# EAGLE design motor (EAGLE 7.7.0)
REVISION: 1.0; SCH_DESC: Motor board; TEAM: RoboCup

## Sheet 1 of 2
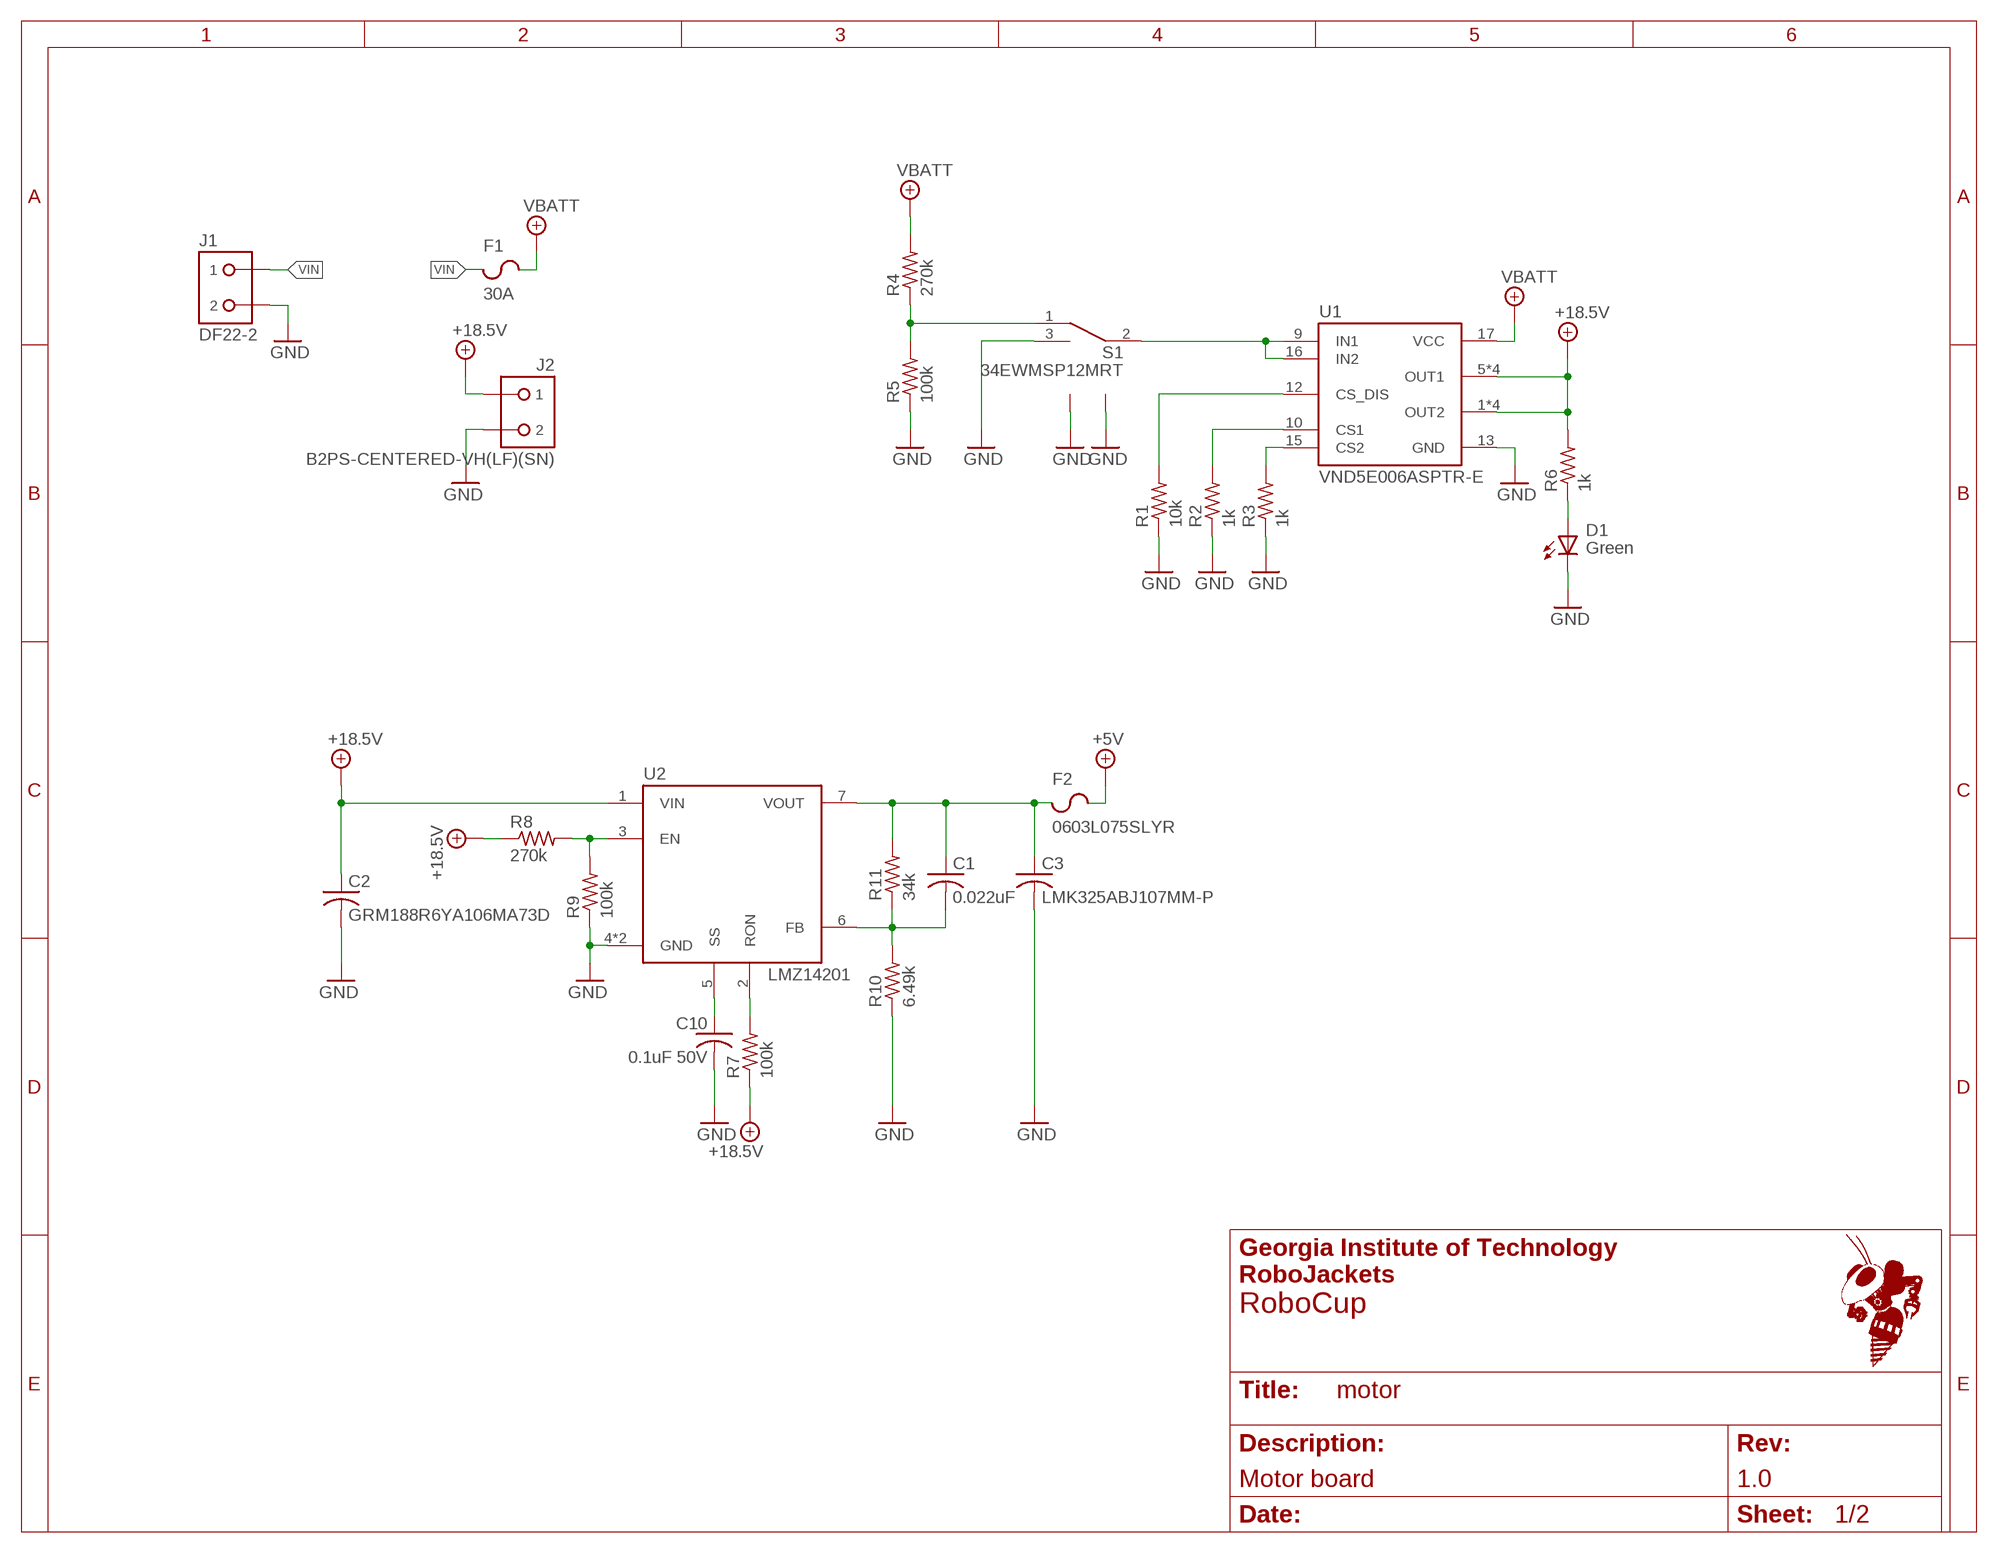
[diagram p0: schematic, sheet 1]

### Parts
C1  0.022uF  C-USC0603  [C0603]
C2  GRM188R6YA106MA73D  C-USC0603  [C0603]
C3  LMK325ABJ107MM-P  C-USC1210  [C1210]
C10  0.1uF 50V  C-USC0603  [C0603]
D1  Green  LED_SMD  [CHIP-LED0603]
F1  30A  FUSEHOLDER_3549_X2  [FUSEHOLDER_3549_X2]
F2  0603L075SLYR  CHIP_FUSE0603  [F0603]
J1  DF22-2  [DF22-2-H]
J2  B2PS-CENTERED-VH(LF)(SN)  [B2PS-CENTERED]
R1  10k  R-US_R0603  [R0603]
R2  1k  R-US_R0603  [R0603]
R3  1k  R-US_R0603  [R0603]
R4  270k  R-US_R0603  [R0603]
R5  100k  R-US_R0603  [R0603]
R6  1k  R-US_R0603  [R0603]
R7  100k  R-US_R0603  [R0603]
R8  270k  R-US_R0603  [R0603]
R9  100k  R-US_R0603  [R0603]
R10  6.49k  R-US_R0603  [R0603]
R11  34k  R-US_R0603  [R0603]
S1  34EWMSP12MRT  [34EWMSP12M6RT]
U1  VND5E006ASPTR-E  [POWERSO-16]
U2  LMZ14201  [TO-PMOD-7]

### Nets
+5V: F2.2
+18.5V: C2.1 J2.1 R6.2 R7.1 R8.1 U1.1(OUT2) U1.2(OUT2) U1.3(OUT2) U1.4(OUT2) U1.5(OUT1) U1.6(OUT1) U1.7(OUT1) U1.8(OUT1) U2.1(VIN) ; also sheet 2
GND: C2.2 C3.2 C10.2 D1.C(K) J1.2 J2.2 R1.1 R2.1 R3.1 R5.1 R9.1 R10.1 S1.3(B) S1.LEG1 S1.LEG3(LEG2) U1.13(GND) U2.4(GND) U2.PAD(GND) ; also sheet 2
N$2: R3.2 U1.15(CS2)
N$3: R2.2 U1.10(CS1)
N$4: R1.2 U1.12(CS_DIS)
N$5: R4.1 R5.2 S1.1(A)
N$6: S1.2(COMMON) U1.9(IN1) U1.16(IN2)
N$7: D1.A R6.1
N$8: C10.1 U2.5(SS)
N$9: R7.2 U2.2(RON)
N$10: R8.2 R9.2 U2.3(EN)
N$11: C1.2 R10.2 R11.1 U2.6(FB)
N$12: C1.1 C3.1 F2.1 R11.2 U2.7(VOUT)
VBATT: F1.2 F1.LEG2 R4.2 U1.17(VCC)
VIN: F1.1 F1.LEG1 J1.1

## Sheet 2 of 2
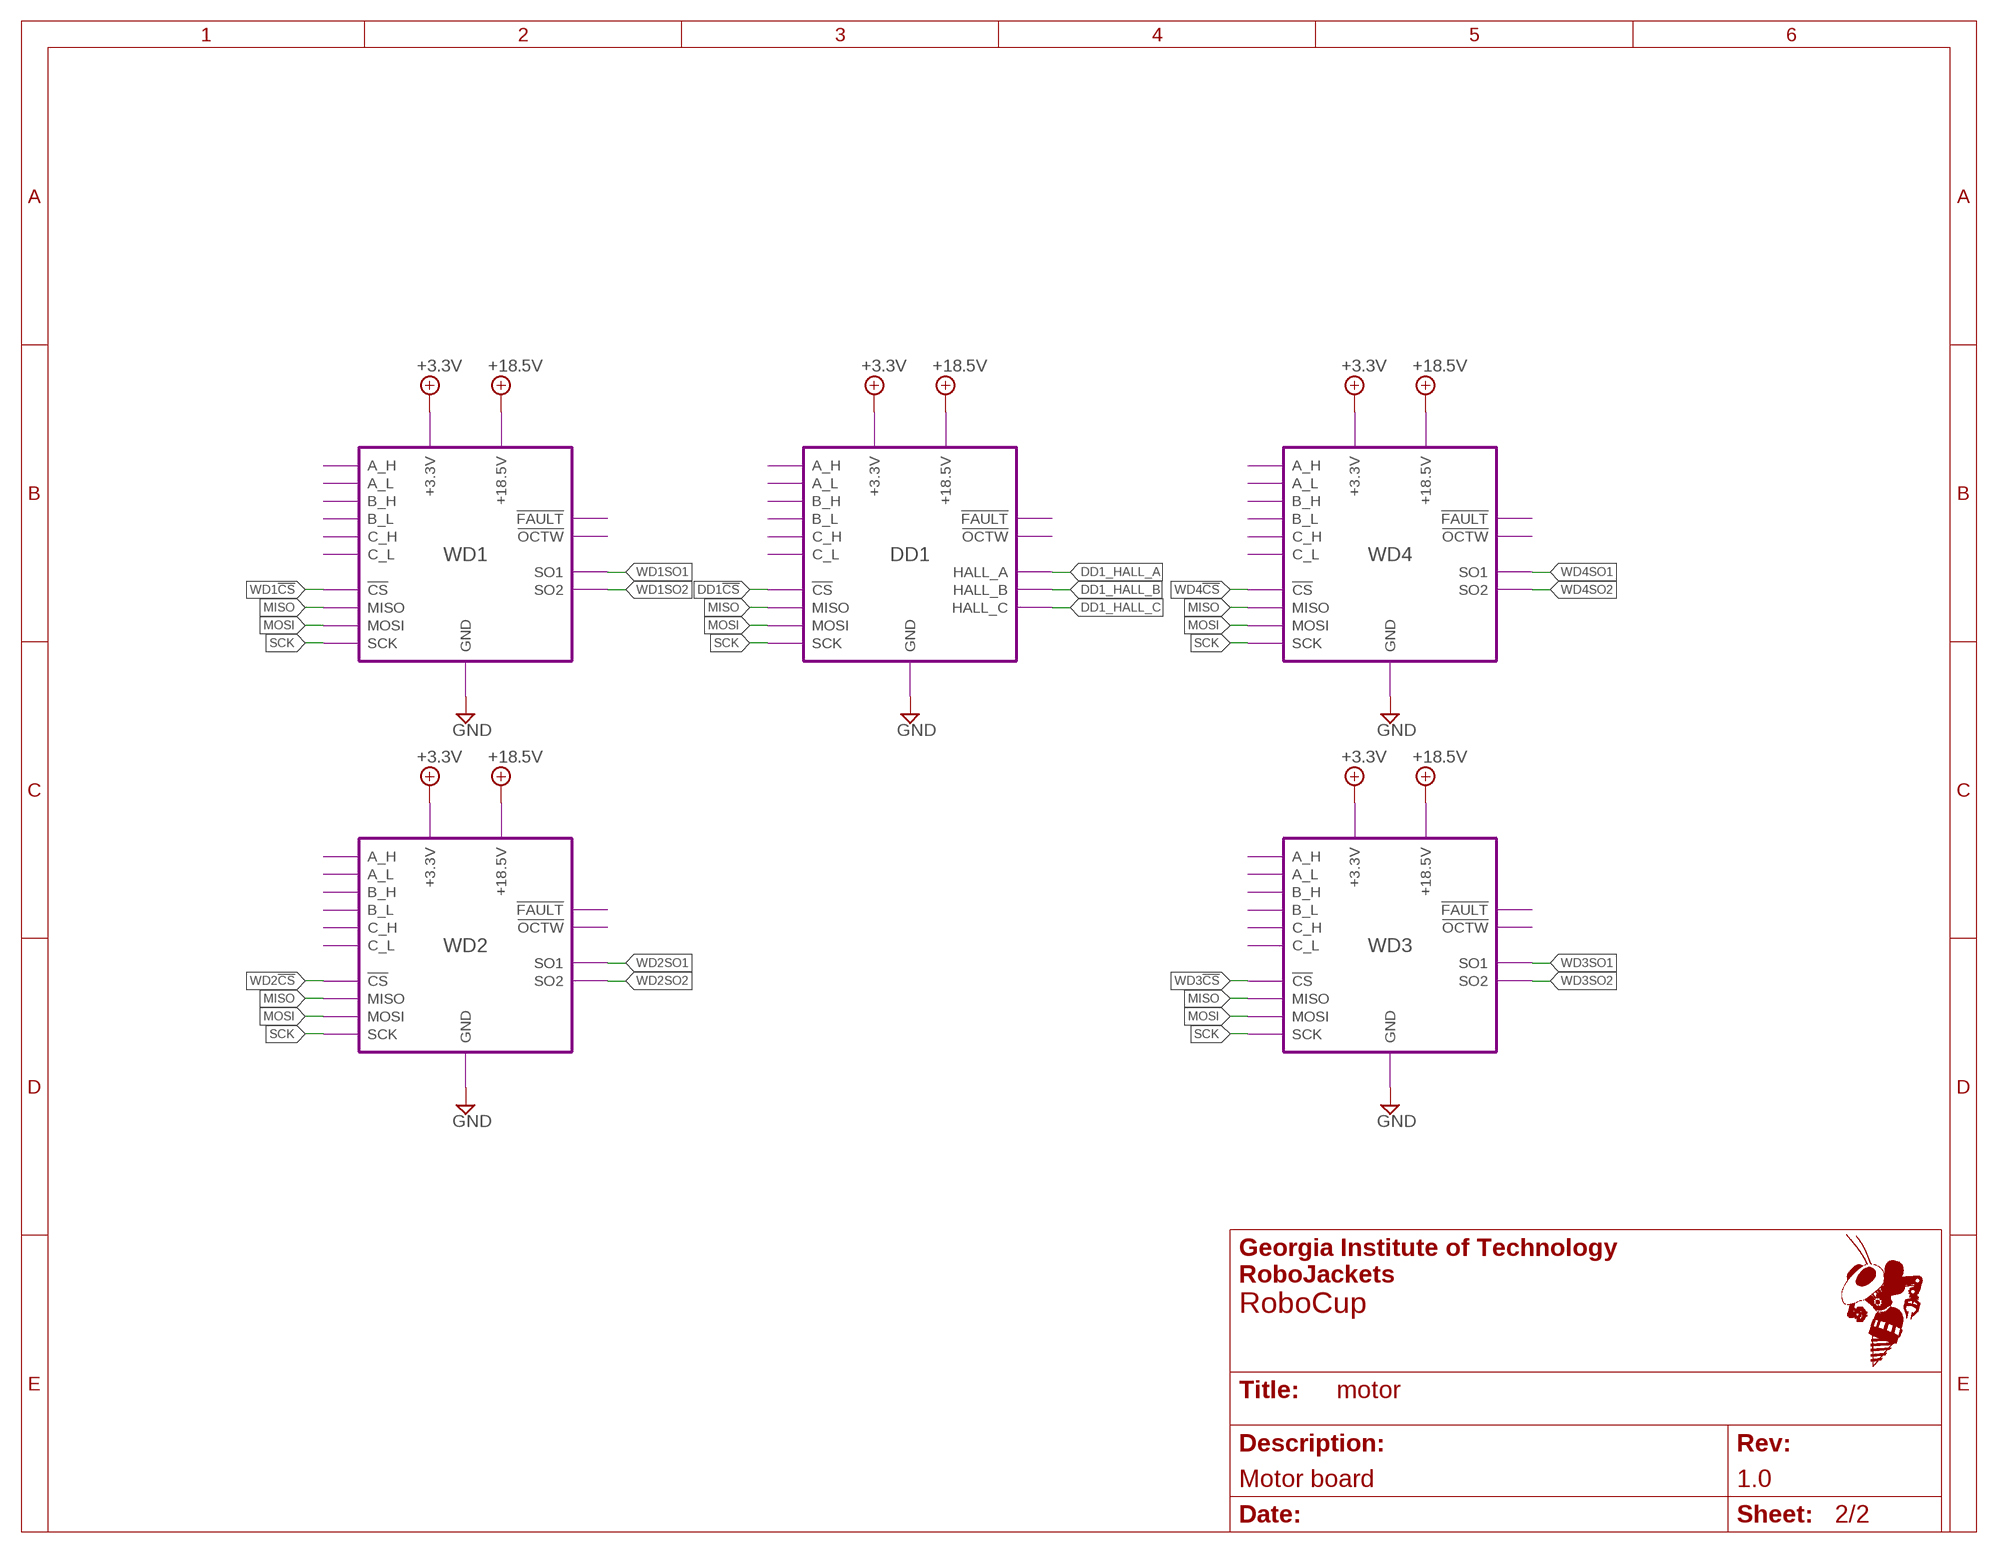
[diagram p1: schematic, sheet 2]

### Module instances
WD1 = WHEEL_DRIVE
WD2 = WHEEL_DRIVE
WD3 = WHEEL_DRIVE
WD4 = WHEEL_DRIVE
DD1 = DRIBBLER_DRIVE

### Nets
+3.3V: port WD1.+3.3V WD2.+3.3V WD4.+3.3V WD3.+3.3V DD1.+3.3V
+18.5V: port WD1.+18.5V WD4.+18.5V WD2.+18.5V WD3.+18.5V DD1.+18.5V ; also sheet 1
DD1!CS: port DD1.!CS
DD1_HALL_A: port DD1.HALL_A
DD1_HALL_B: port DD1.HALL_B
DD1_HALL_C: port DD1.HALL_C
GND: port WD1.GND WD4.GND WD3.GND WD2.GND DD1.GND ; also sheet 1
MISO: port WD1.MISO WD2.MISO DD1.MISO WD4.MISO WD3.MISO
MOSI: port WD1.MOSI WD2.MOSI DD1.MOSI WD4.MOSI WD3.MOSI
SCK: port WD1.SCK WD2.SCK DD1.SCK WD4.SCK WD3.SCK
WD1!CS: port WD1.!CS
WD1SO1: port WD1.SO1
WD1SO2: port WD1.SO2
WD2!CS: port WD2.!CS
WD2SO1: port WD2.SO1
WD2SO2: port WD2.SO2
WD3!CS: port WD3.!CS
WD3SO1: port WD3.SO1
WD3SO2: port WD3.SO2
WD4!CS: port WD4.!CS
WD4SO1: port WD4.SO1
WD4SO2: port WD4.SO2

## Library data of the parts
C1-C3 C10 = rcl:C-US: CAPACITOR, American symbol
D1 = RoboJackets-LEDs:LED_SMD
F1 = RoboJackets-Fuses:FUSEHOLDER_3549_X2: Keystone Electronics Fuse Clip 30A 500V Circuit Blade PCB 3549
F2 = RoboJackets-Fuses:CHIP_FUSE
J1 = RoboJackets-Connectors:DF22-2
J2 = RoboJackets-Connectors:B2P?-VH(LF)(SN): Power Connector Brand: JST Sales America Inc. <https://www.jst.com/> Series: VH <http://www.digikey.com/product-search/en?FV=fff40016,fff802f3,ffec0e9d> Distributor: Digi-Key <http://www.digikey.com/product-detail/en/B2PS-VH%28LF%29%28SN%29/455-1648-ND/926555>
R1-R11 = rcl:R-US_: RESISTOR, American symbol
S1 = RoboJackets-Switches:34EWMSP12MRT
U1 = RoboJackets-PowerICs:VND5E006ASPTR-E
U2 = RoboJackets-PowerICs:LMZ14201

## Module WHEEL_DRIVE
Ports: A_H(io) A_L(io) B_H(io) B_L(io) C_H(io) C_L(io) !CS(io) !FAULT(io) !OCTW(io) +18.5V(io) +3.3V(io) GND(io) MISO(io) MOSI(io) SCK(io) SO1(io) SO2(io)
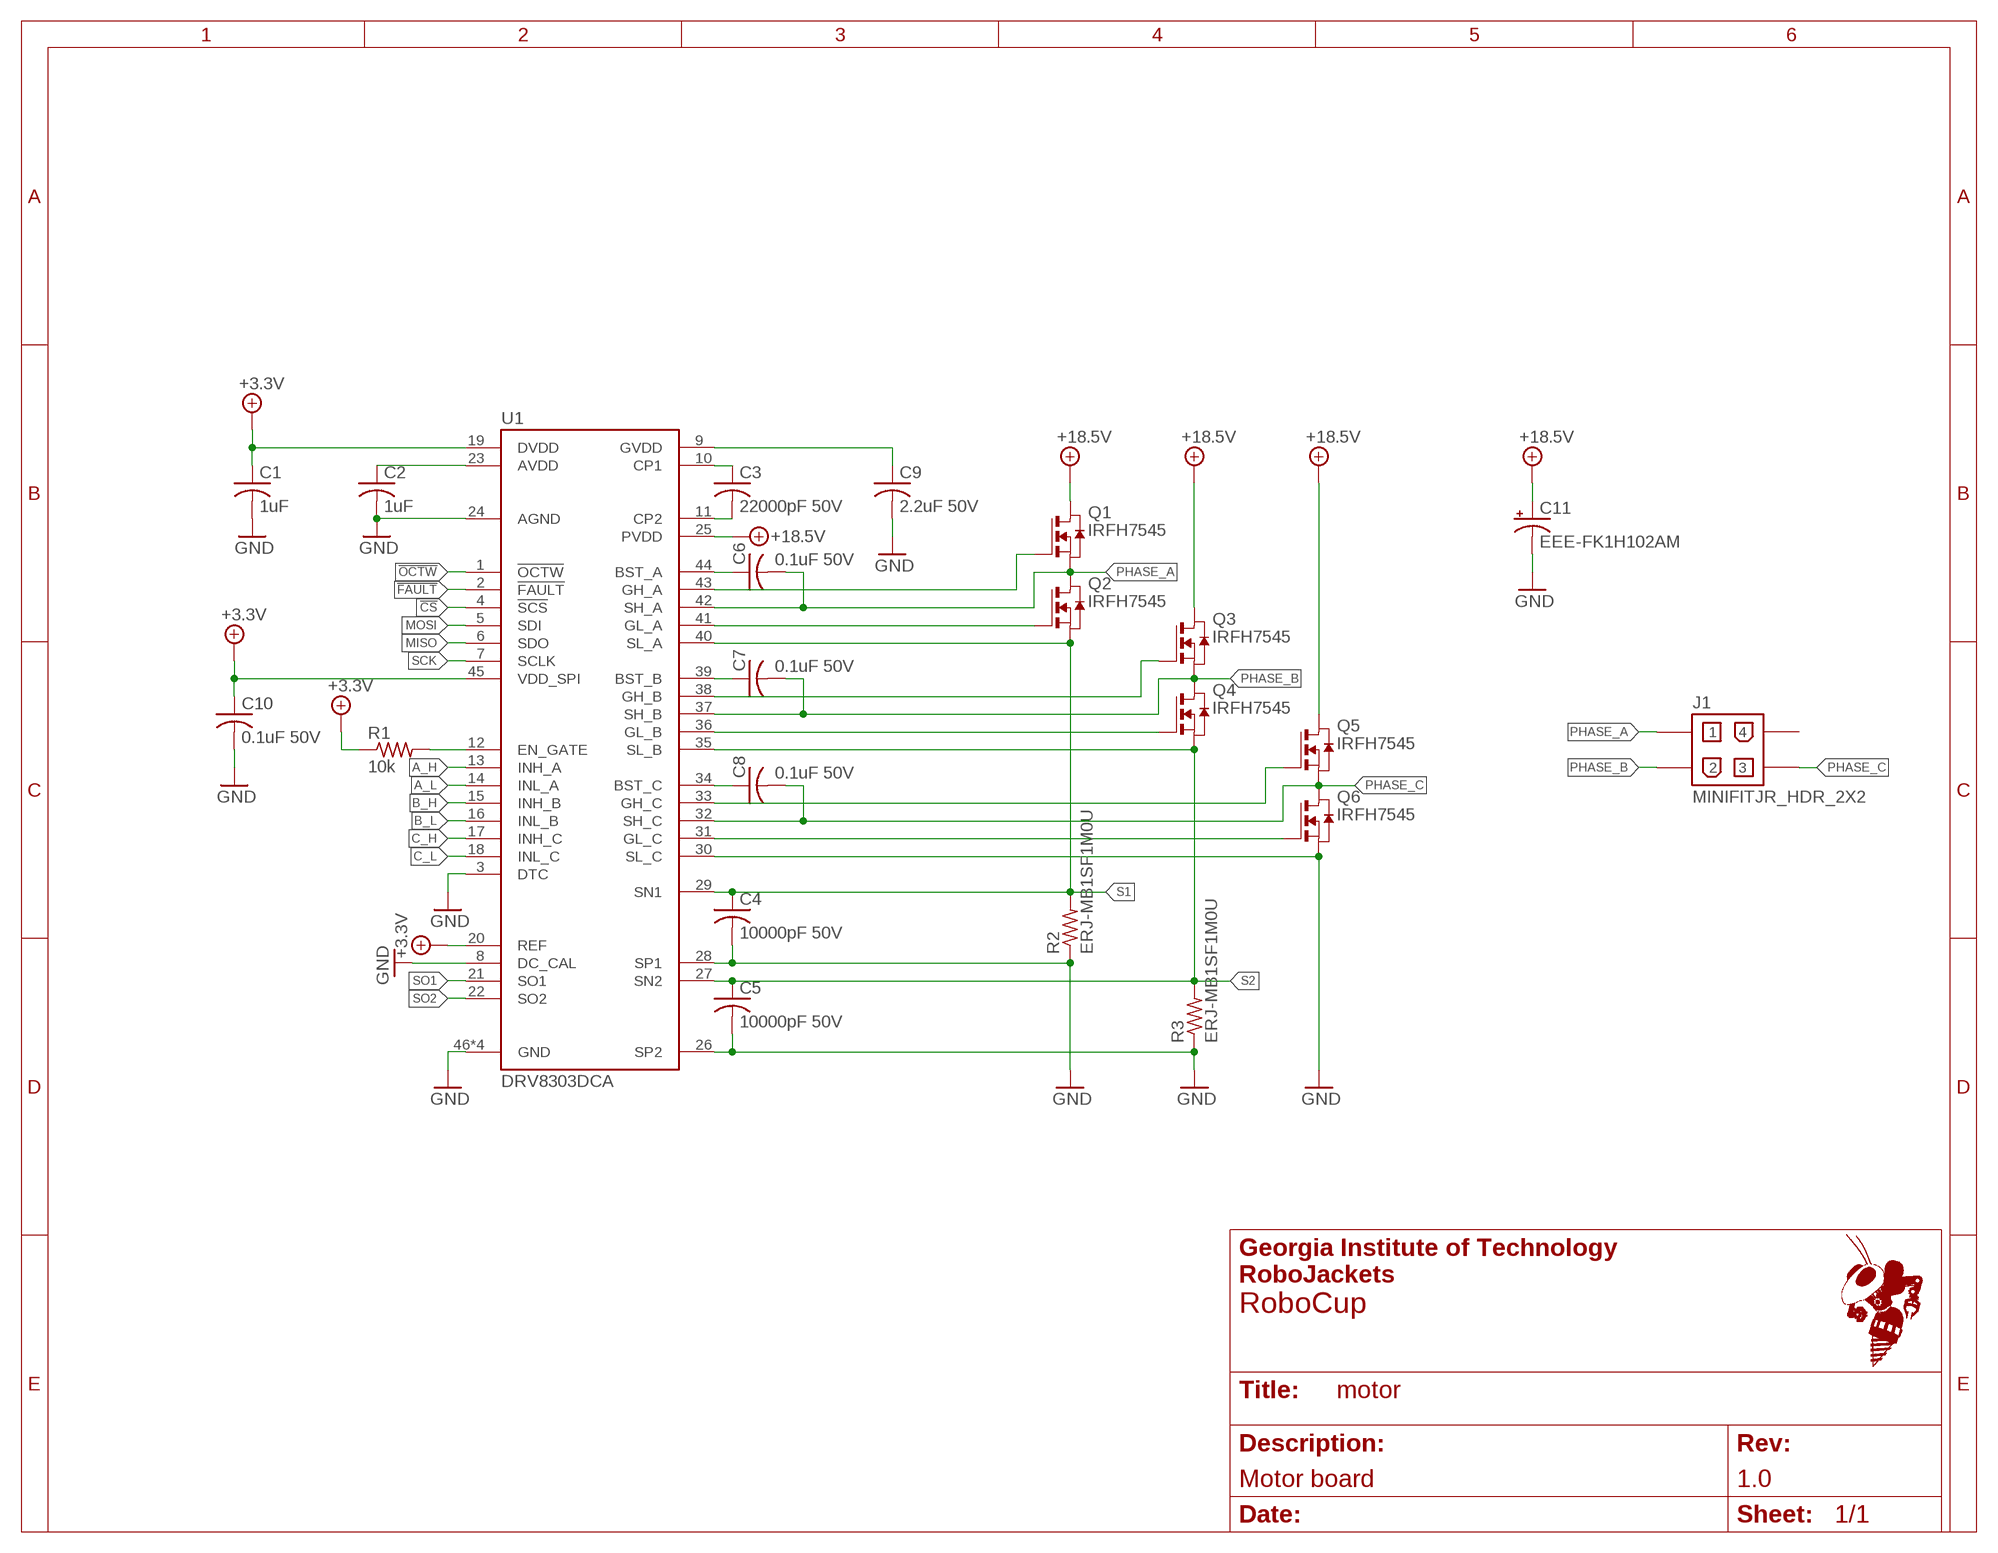
[diagram p2: schematic, module WHEEL_DRIVE, sheet 1]

### Parts
C1  1uF  C-USC0603  [C0603]
C2  1uF  C-USC0603  [C0603]
C3  22000pF 50V  C-USC0603  [C0603]
C4  10000pF 50V  C-USC0603  [C0603]
C5  10000pF 50V  C-USC0603  [C0603]
C6  0.1uF 50V  C-USC0603  [C0603]
C7  0.1uF 50V  C-USC0603  [C0603]
C8  0.1uF 50V  C-USC0603  [C0603]
C9  2.2uF 50V  C-USC0603  [C0603]
C10  0.1uF 50V  C-USC0603  [C0603]
C11  EEE-FK1H102AM  PANASONIC_J16  [PANASONIC_J16]
J1  MINIFITJR_HDR_2X2  [0039301040]
Q1  IRFH7545  [PQFN_5X6_E]
Q2  IRFH7545  [PQFN_5X6_E]
Q3  IRFH7545  [PQFN_5X6_E]
Q4  IRFH7545  [PQFN_5X6_E]
Q5  IRFH7545  [PQFN_5X6_E]
Q6  IRFH7545  [PQFN_5X6_E]
R1  10k  R-US_R0603  [R0603]
R2  ERJ-MB1SF1M0U  R-US_R2010  [R2010]
R3  ERJ-MB1SF1M0U  R-US_R2010  [R2010]
U1  DRV8303DCA  [TSSOP-48_PAD]

### Nets
!CS: U1.4(!SCS)
!FAULT: U1.2(!FAULT)
!OCTW: U1.1(!OCTW)
+3.3V: C1.1 C10.1 R1.1 U1.19(DVDD) U1.20(REF) U1.45(VDD_SPI)
+18.5V: C11.+ Q1.5678(D) Q3.5678(D) Q5.5678(D) U1.25(PVDD)
A_H: U1.13(INH_A)
A_L: U1.14(INL_A)
B_H: U1.15(INH_B)
B_L: U1.16(INL_B)
C_H: U1.17(INH_C)
C_L: U1.18(INL_C)
GND: C1.2 C2.2 C4.2 C5.2 C9.2 C10.2 C11.- Q6.1(S) Q6.2(S) Q6.3(S) R2.1 R3.1 U1.3(DTC) U1.8(DC_CAL) U1.24(AGND) U1.26(SP2) U1.28(SP1) U1.30(SL_C) U1.46(GND) U1.47(GND) U1.48(GND) U1.PAD(GND)
MISO: U1.6(SDO)
MOSI: U1.5(SDI)
N$1: C2.1 U1.23(AVDD)
N$2: C3.1 U1.10(CP1)
N$3: C3.2 U1.11(CP2)
N$4: C9.1 U1.9(GVDD)
N$6: Q2.4(G) U1.41(GL_A)
N$8: Q1.4(G) U1.43(GH_A)
N$10: Q4.4(G) U1.36(GL_B)
N$12: Q3.4(G) U1.38(GH_B)
N$13: C6.1 U1.44(BST_A)
N$14: C7.1 U1.39(BST_B)
N$16: Q6.4(G) U1.31(GL_C)
N$17: Q5.4(G) U1.33(GH_C)
N$18: C8.1 U1.34(BST_C)
N$19: R1.2 U1.12(EN_GATE)
PHASE_A: C6.2 J1.1 Q1.1(S) Q1.2(S) Q1.3(S) Q2.5678(D) U1.42(SH_A)
PHASE_B: C7.2 J1.2 Q3.1(S) Q3.2(S) Q3.3(S) Q4.5678(D) U1.37(SH_B)
PHASE_C: C8.2 J1.3 Q5.1(S) Q5.2(S) Q5.3(S) Q6.5678(D) U1.32(SH_C)
S1: C4.1 Q2.1(S) Q2.2(S) Q2.3(S) R2.2 U1.29(SN1) U1.40(SL_A)
S2: C5.1 Q4.1(S) Q4.2(S) Q4.3(S) R3.2 U1.27(SN2) U1.35(SL_B)
SCK: U1.7(SCLK)
SO1: U1.21(SO1)
SO2: U1.22(SO2)
Unconnected: J1.4

### Library data of the parts
C1-C10 = rcl:C-US: CAPACITOR, American symbol
C11 = RoboJackets-Capacitors:PANASONIC_J16
J1 = RoboJackets-Connectors:MINIFITJR_HDR_2X2
Q1-Q6 = RoboJackets-Discrete:IRFH7545
R1-R3 = rcl:R-US_: RESISTOR, American symbol
U1 = RoboJackets-PowerICs:DRV8303

## Module DRIBBLER_DRIVE
Ports: A_H(io) A_L(io) B_H(io) B_L(io) C_H(io) C_L(io) !CS(io) MISO(io) MOSI(io) SCK(io) GND(io) +3.3V(io) +18.5V(io) !FAULT(io) !OCTW(io) HALL_A(io) HALL_B(io) HALL_C(io)
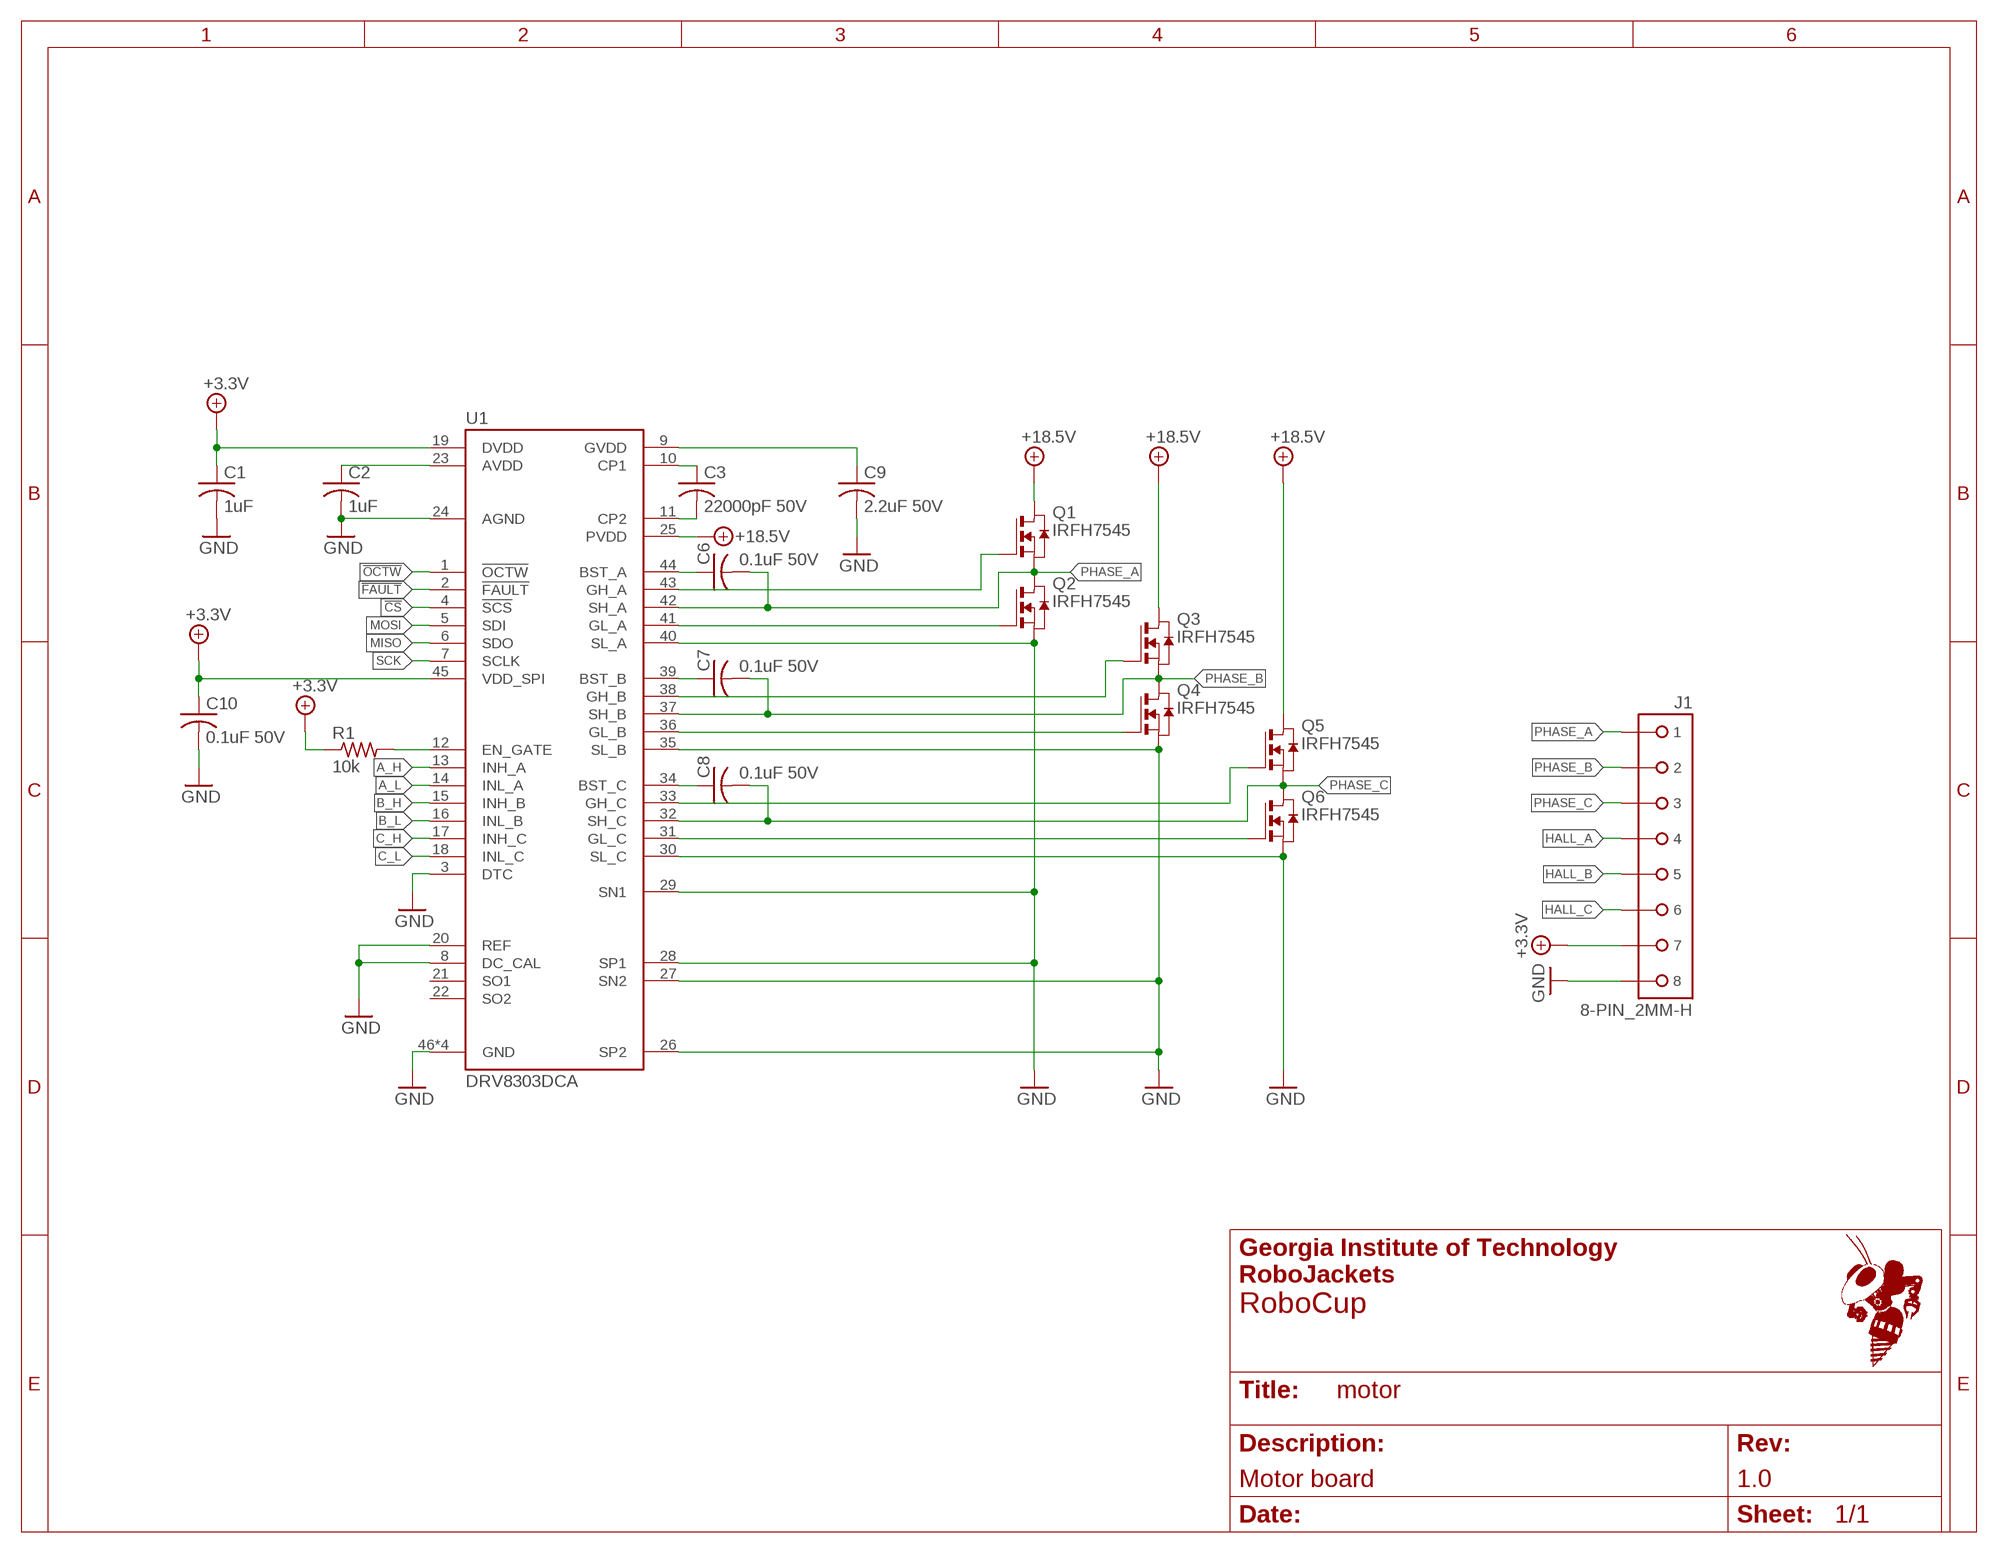
[diagram p3: schematic, module DRIBBLER_DRIVE, sheet 1]

### Parts
C1  1uF  C-USC0603  [C0603]
C2  1uF  C-USC0603  [C0603]
C3  22000pF 50V  C-USC0603  [C0603]
C6  0.1uF 50V  C-USC0603  [C0603]
C7  0.1uF 50V  C-USC0603  [C0603]
C8  0.1uF 50V  C-USC0603  [C0603]
C9  2.2uF 50V  C-USC0603  [C0603]
C10  0.1uF 50V  C-USC0603  [C0603]
J1  8-PIN_2MM-H  [2MM-8-H]
Q1  IRFH7545  [PQFN_5X6_E]
Q2  IRFH7545  [PQFN_5X6_E]
Q3  IRFH7545  [PQFN_5X6_E]
Q4  IRFH7545  [PQFN_5X6_E]
Q5  IRFH7545  [PQFN_5X6_E]
Q6  IRFH7545  [PQFN_5X6_E]
R1  10k  R-US_R0603  [R0603]
U1  DRV8303DCA  [TSSOP-48_PAD]

### Nets
!CS: U1.4(!SCS)
!FAULT: U1.2(!FAULT)
!OCTW: U1.1(!OCTW)
+3.3V: C1.1 C10.1 J1.7 R1.1 U1.19(DVDD) U1.45(VDD_SPI)
+18.5V: Q1.5678(D) Q3.5678(D) Q5.5678(D) U1.25(PVDD)
A_H: U1.13(INH_A)
A_L: U1.14(INL_A)
B_H: U1.15(INH_B)
B_L: U1.16(INL_B)
C_H: U1.17(INH_C)
C_L: U1.18(INL_C)
GND: C1.2 C2.2 C9.2 C10.2 J1.8 Q2.1(S) Q2.2(S) Q2.3(S) Q4.1(S) Q4.2(S) Q4.3(S) Q6.1(S) Q6.2(S) Q6.3(S) U1.3(DTC) U1.8(DC_CAL) U1.20(REF) U1.24(AGND) U1.26(SP2) U1.27(SN2) U1.28(SP1) U1.29(SN1) U1.30(SL_C) U1.35(SL_B) U1.40(SL_A) U1.46(GND) U1.47(GND) U1.48(GND) U1.PAD(GND)
HALL_A: J1.4
HALL_B: J1.5
HALL_C: J1.6
MISO: U1.6(SDO)
MOSI: U1.5(SDI)
N$1: C2.1 U1.23(AVDD)
N$2: C3.1 U1.10(CP1)
N$3: C3.2 U1.11(CP2)
N$4: C9.1 U1.9(GVDD)
N$6: Q2.4(G) U1.41(GL_A)
N$8: Q1.4(G) U1.43(GH_A)
N$10: Q4.4(G) U1.36(GL_B)
N$12: Q3.4(G) U1.38(GH_B)
N$13: C6.1 U1.44(BST_A)
N$14: C7.1 U1.39(BST_B)
N$16: Q6.4(G) U1.31(GL_C)
N$17: Q5.4(G) U1.33(GH_C)
N$18: C8.1 U1.34(BST_C)
N$19: R1.2 U1.12(EN_GATE)
PHASE_A: C6.2 J1.1 Q1.1(S) Q1.2(S) Q1.3(S) Q2.5678(D) U1.42(SH_A)
PHASE_B: C7.2 J1.2 Q3.1(S) Q3.2(S) Q3.3(S) Q4.5678(D) U1.37(SH_B)
PHASE_C: C8.2 J1.3 Q5.1(S) Q5.2(S) Q5.3(S) Q6.5678(D) U1.32(SH_C)
SCK: U1.7(SCLK)
Unconnected: U1.21(SO1) U1.22(SO2)

### Library data of the parts
C1-C3 C6-C10 = rcl:C-US: CAPACITOR, American symbol
J1 = RoboJackets-Connectors:8-PIN_2MM-*; PINS: 8; PIN_PITCH: 2.0 mm
Q1-Q6 = RoboJackets-Discrete:IRFH7545
R1 = rcl:R-US_: RESISTOR, American symbol
U1 = RoboJackets-PowerICs:DRV8303

## Board
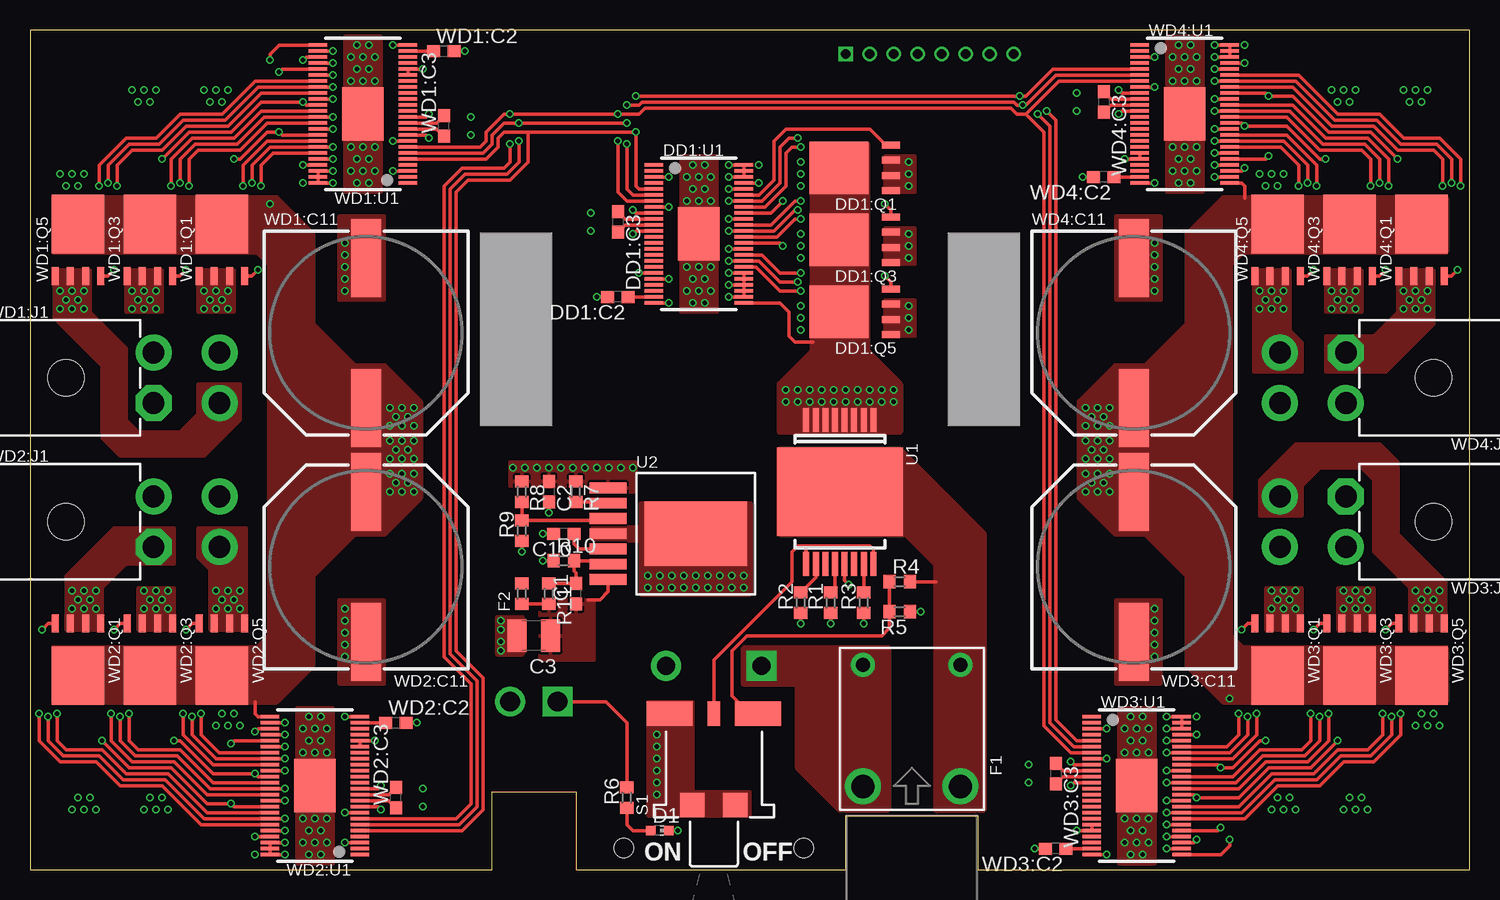
[diagram p4: board, top side]
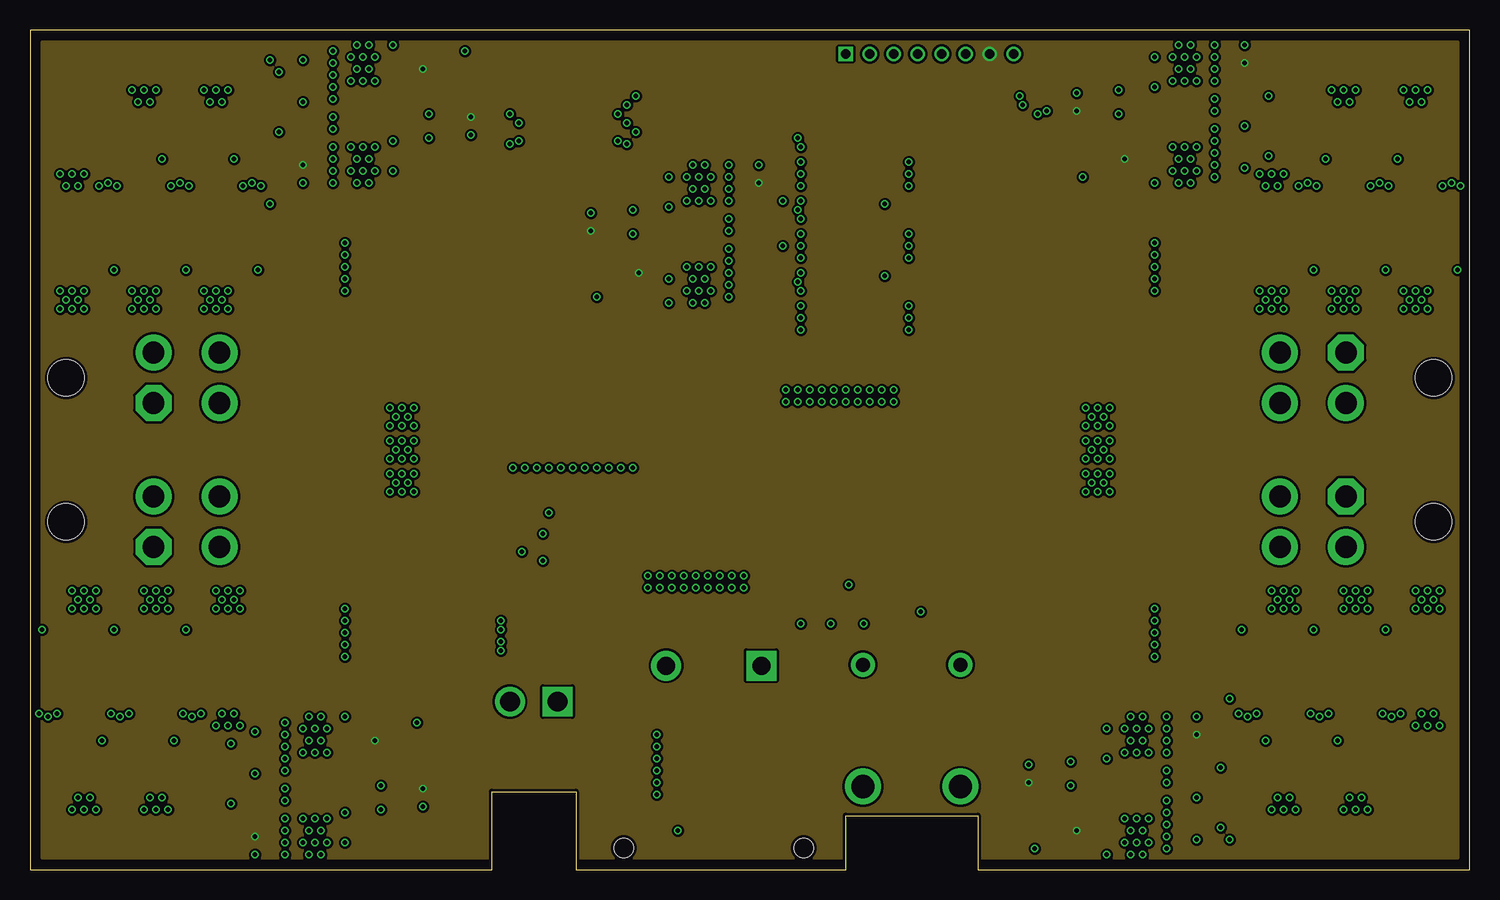
[diagram p5: board, inner layer POWER_Layer]
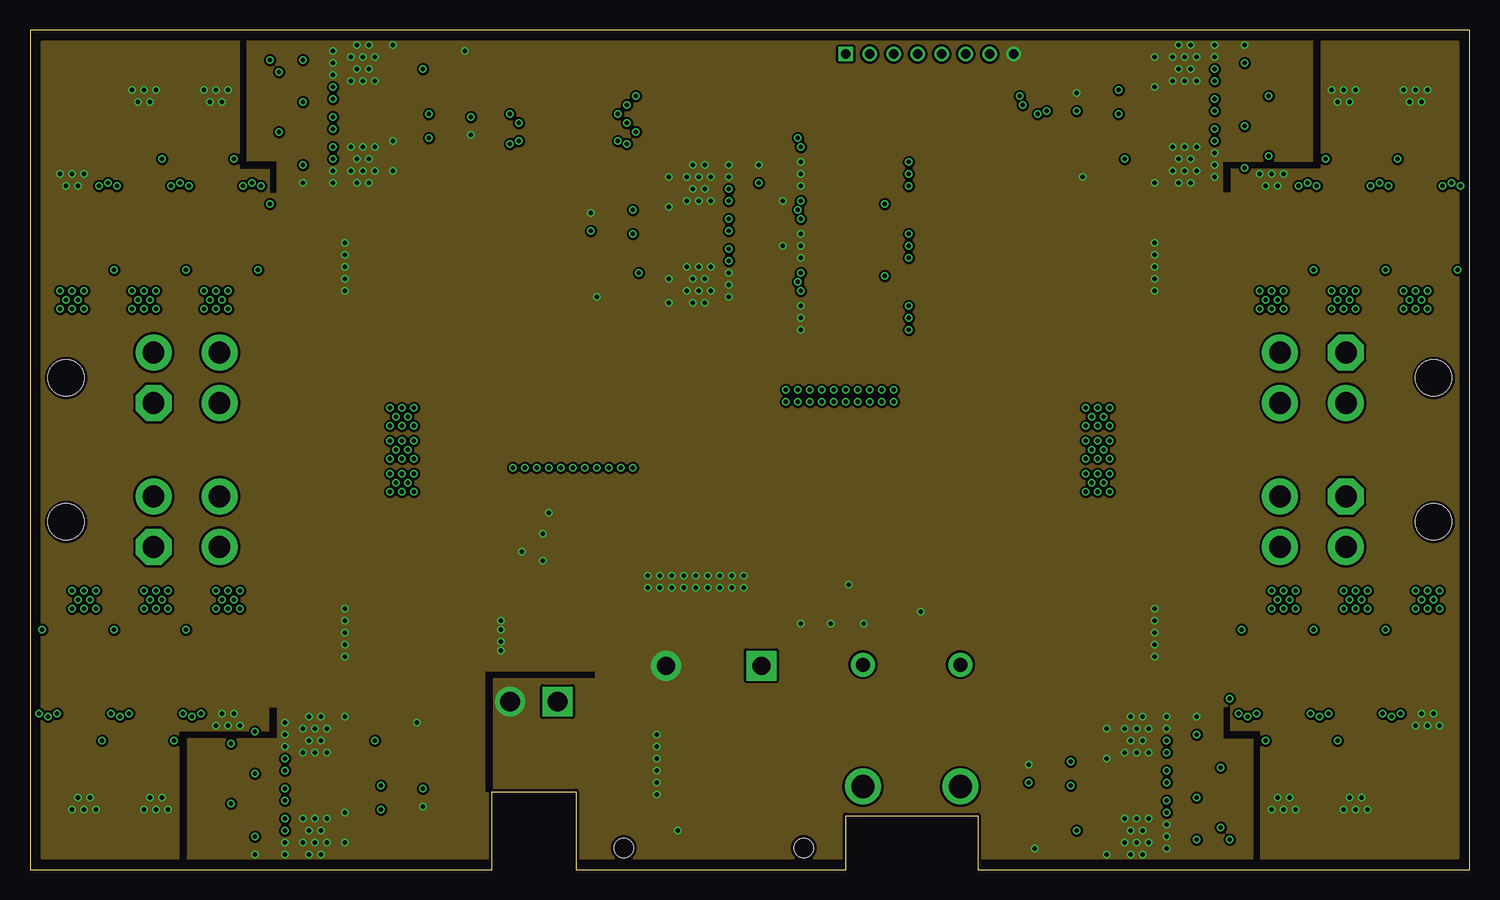
[diagram p6: board, inner layer GND_Layer]
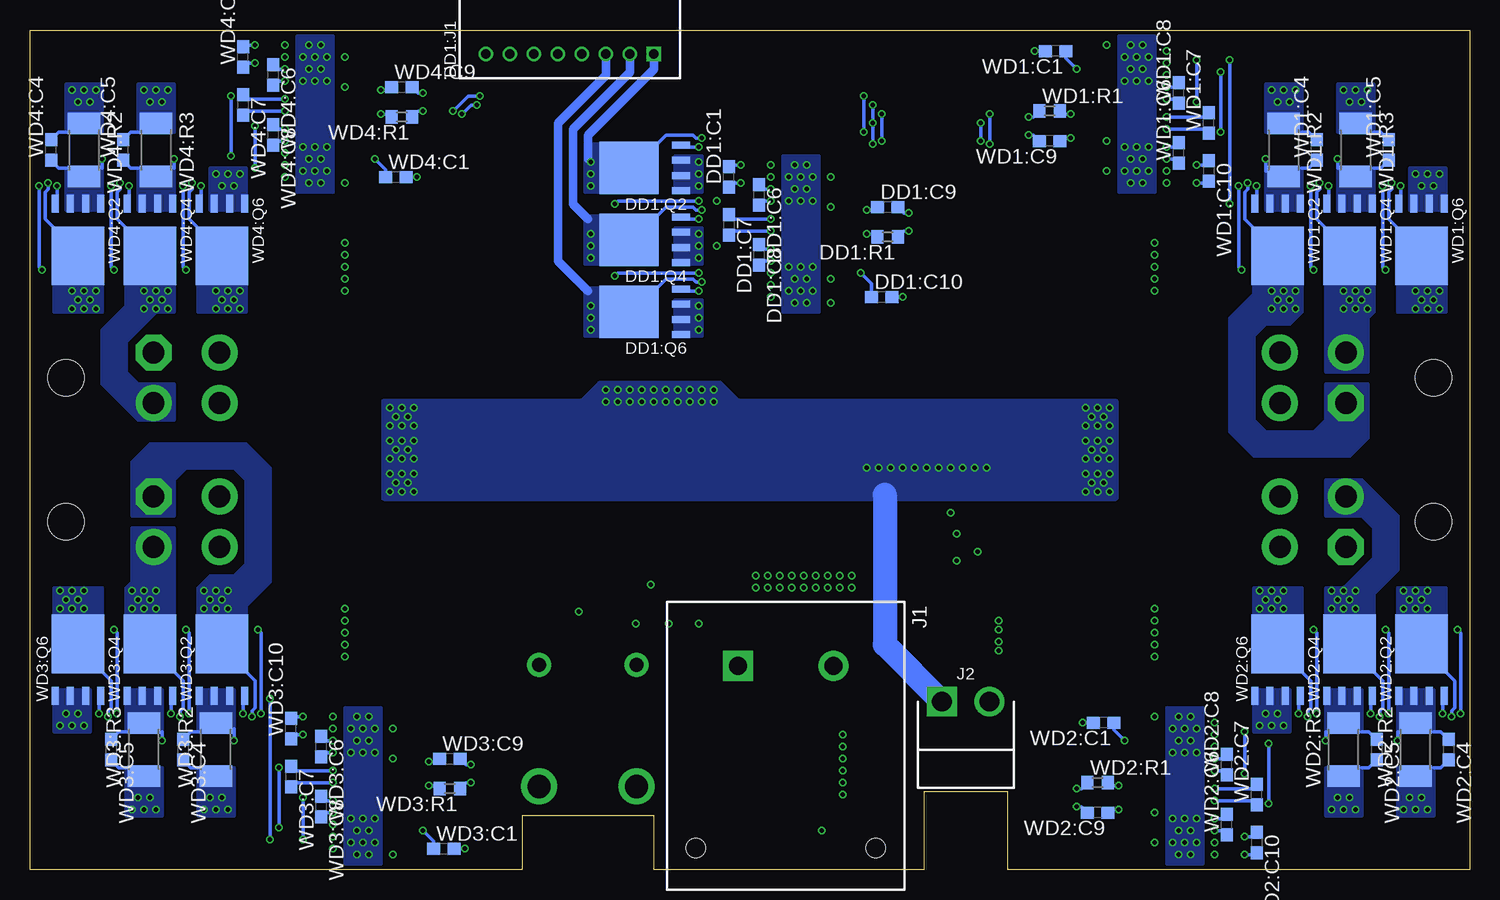
[diagram p7: board, bottom side, seen from below]

Size 120 x 70 mm. Coordinates in mm from the lower left corner, seen from the top.
Outline: 0,0 38.5,0 38.5,6.5 45.5,6.5 45.5,0 68,0 68,4.5 79,4.5 79,0 120,0 120,70 0,70 0,0
Copper layers (1+2*3+16): Top 0.035mm / dielectric 0.36mm / POWER_Layer 0.035mm / dielectric 0.71mm / GND_Layer 0.035mm / dielectric 0.36mm / Bottom 0.035mm
Design rules "eC_4Layer_PClass6_BaseCopperO35-I35 *": minimum track width 0.15mm, minimum drill 0.35mm, track to track 0.175mm, track to pad 0.175mm, pad to pad 0.175mm, via to via 0.175mm, smd to smd 0mil, copper to edge 0.25mm, drill to drill 0.35mm, minimum pad ring 0.175mm, minimum via ring 0.125mm, stop-mask expansion 0mil, vias tented up to drill 0.45mm, thermal gap 0.2mm

### Footprints (pad centres in the part's own frame; a part is rotated, then mirrored left to right if it is on the bottom)
C0603 = smd 1.1 x 1: 1 -0.85,0; 2 0.85,0
C1210 = smd 1.6 x 2.7: 1 -1.4,0; 2 1.4,0
CHIP-LED0603 = smd 0.8 x 0.8: A 0,-0.75; C 0,0.75
2MM-8-H = drill 0.8 square: 1 -7,0 | drill 0.8: 2 -5,0; 3 -3,0; 4 -1,0; 5 1,0; 6 3,0; 7 5,0; 8 7,0
PQFN_5X6_E = smd 1.5 x 0.6: 1 -3.02,1.905; 2 -3.02,0.635; 3 -3.02,-0.635; 4 -3.02,-1.905 | smd 4.895 x 4.41: 5678 1.323,0
R0603 = smd 1 x 1.1: 1 -0.85,0; 2 0.85,0
TSSOP-48_PAD = smd 0.3 x 1.55: 1 -5.75,-3.75; 2 -5.25,-3.75; 3 -4.75,-3.75; 4 -4.25,-3.75; 5 -3.75,-3.75; 6 -3.25,-3.75; 7 -2.75,-3.75; 8 -2.25,-3.75; 9 -1.75,-3.75; 10 -1.25,-3.75; 11 -0.75,-3.75; 12 -0.25,-3.75; 13 0.25,-3.75; 14 0.75,-3.75; 15 1.25,-3.75; 16 1.75,-3.75; 17 2.25,-3.75; 18 2.75,-3.75; 19 3.25,-3.75; 20 3.75,-3.75; 21 4.25,-3.75; 22 4.75,-3.75; 23 5.25,-3.75; 24 5.75,-3.75; 25 5.75,3.75; 26 5.25,3.75; 27 4.75,3.75; 28 4.25,3.75; 29 3.75,3.75; 30 3.25,3.75; 31 2.75,3.75; 32 2.25,3.75; 33 1.75,3.75; 34 1.25,3.75; 35 0.75,3.75; 36 0.25,3.75; 37 -0.25,3.75; 38 -0.75,3.75; 39 -1.25,3.75; 40 -1.75,3.75; 41 -2.25,3.75; 42 -2.75,3.75; 43 -3.25,3.75; 44 -3.75,3.75; 45 -4.25,3.75; 46 -4.75,3.75; 47 -5.25,3.75; 48 -5.75,3.75 | smd 4.42 x 3.483: PAD 0,0
FUSEHOLDER_3549_X2 = drill 1.93 pad 3: 1 -4.065,-5.08; 2 4.065,-5.08 | drill 1.17 pad 2: LEG1 -4.065,5.08; LEG2 4.065,5.08
F0603 = smd 1 x 1.1: 1 -0.85,0; 2 0.85,0
DF22-2-H = drill 1.5 pad 2.5 square: 1 3.96,0 | drill 1.5 pad 2.5: 2 -3.96,0 | hole 1.6: -7.5,15.2; 7.5,15.2
B2PS-CENTERED = drill 1.65 square: 1 -1.98,0 | drill 1.65: 2 1.98,0
34EWMSP12M6RT = smd 3.81 x 2.03: 1 -3.685,0; 3 3.685,0 | smd 1.02 x 2.03: 2 0,0 | smd 2.03 x 2.03: LEG1 -1.78,7.62; LEG3 1.78,7.62
POWERSO-16 = smd 0.5 x 2: 1 -2.8,-6; 2 -2,-6; 3 -1.2,-6; 4 -0.4,-6; 5 0.4,-6; 6 1.2,-6; 7 2,-6; 8 2.8,-6; 9 2.8,6; 10 2,6; 11 1.2,6; 12 0.4,6; 13 -0.4,6; 14 -1.2,6; 15 -2,6; 16 -2.8,6 | smd 10.5 x 7.4: 17 0,0
TO-PMOD-7 = smd 0.89 x 3.06: 1 -3.81,-7.305; 2 -2.54,-7.305; 3 -1.27,-7.305; 4 0,-7.305; 5 1.27,-7.305; 6 2.54,-7.305; 7 3.81,-7.305 | smd 5.35 x 8.54: PAD 0,0
PANASONIC_J16 = smd 2.5 x 6.5: + 0,-6.25; - 0,6.25
0039301040 = drill 1.8 pad 3 octagon: 1 2.1,7.3 | drill 1.8 pad 3: 2 -2.1,7.3; 3 2.1,12.8; 4 -2.1,12.8 | hole 3: 0,0
R2010 = smd 1.8 x 2.7: 1 -2.2,0; 2 2.2,0

### Placement (x,y rotation side)
C1  45.5,23 90 top
C2  43.25,31.5 270 top
C3  42,19.5 180 top
C10  44.5,28 180 top
D1  52.5,3.25 270 top
DD1:C1  1uF  [C0603]  61.75,57.75 90 bottom
DD1:C2  1uF  [C0603]  49,47.75 180 top
DD1:C3  22000pF 50V  [C0603]  49,54 270 top
DD1:C6  0.1uF 50V  [C0603]  59.25,56.25 270 bottom
DD1:C7  0.1uF 50V  [C0603]  61.75,53.75 270 bottom
DD1:C8  0.1uF 50V  [C0603]  59.25,51.25 270 bottom
DD1:C9  2.2uF 50V  [C0603]  48.5,55.25 0 bottom
DD1:C10  0.1uF 50V  [C0603]  49,47.75 0 bottom
DD1:J1  8-PIN_2MM-H  [2MM-8-H]  75,68 180 bottom
DD1:Q1  IRFH7545  [PQFN_5X6_E]  68.75,58.5 180 top
DD1:Q2  IRFH7545  [PQFN_5X6_E]  68.75,58.5 180 bottom
DD1:Q3  IRFH7545  [PQFN_5X6_E]  68.75,52.5 180 top
DD1:Q4  IRFH7545  [PQFN_5X6_E]  68.75,52.5 180 bottom
DD1:Q5  IRFH7545  [PQFN_5X6_E]  68.75,46.5 180 top
DD1:Q6  IRFH7545  [PQFN_5X6_E]  68.75,46.5 180 bottom
DD1:R1  10k  [R0603]  48.5,52.75 180 bottom
DD1:U1  DRV8303DCA  [TSSOP-48_PAD]  55.75,53 270 top
F1  73.5,12 0 top
F2  41,23 90 top
J1  57,17 180 bottom
J2  42,14 0 bottom
R1  66.75,22.25 90 top
R2  64.25,22.25 90 top
R3  69.5,22.25 90 top
R4  72.5,24 0 top
R5  72.5,21.5 180 top
R6  49.75,6 90 top
R7  45.5,31.5 270 top
R8  41,31.5 270 top
R9  41,28.25 90 top
R10  44.5,25.75 0 top
R11  43.25,23 270 top
S1  57,13 180 top
U1  67.5,31.5 180 top
U2  55.5,28 270 top
WD1:C1  1uF  [C0603]  34.5,68.25 180 bottom
WD1:C2  1uF  [C0603]  34.5,68.25 0 top
WD1:C3  22000pF 50V  [C0603]  34.5,62 90 top
WD1:C4  10000pF 50V  [C0603]  12.75,60 90 bottom
WD1:C5  10000pF 50V  [C0603]  6.75,60 90 bottom
WD1:C6  0.1uF 50V  [C0603]  24.25,59.75 90 bottom
WD1:C7  0.1uF 50V  [C0603]  21.75,62.25 90 bottom
WD1:C8  0.1uF 50V  [C0603]  24.25,64.75 90 bottom
WD1:C9  2.2uF 50V  [C0603]  35,60.75 180 bottom
WD1:C10  0.1uF 50V  [C0603]  21.75,58.25 270 bottom
WD1:C11  EEE-FK1H102AM  [PANASONIC_J16]  28,44.75 0 top
WD1:J1  MINIFITJR_HDR_2X2  [0039301040]  3,41 270 top
WD1:Q1  IRFH7545  [PQFN_5X6_E]  16,52.5 90 top
WD1:Q2  IRFH7545  [PQFN_5X6_E]  16,52.5 270 bottom
WD1:Q3  IRFH7545  [PQFN_5X6_E]  10,52.5 90 top
WD1:Q4  IRFH7545  [PQFN_5X6_E]  10,52.5 270 bottom
WD1:Q5  IRFH7545  [PQFN_5X6_E]  4,52.5 90 top
WD1:Q6  IRFH7545  [PQFN_5X6_E]  4,52.5 270 bottom
WD1:R1  10k  [R0603]  35,63.25 0 bottom
WD1:R2  ERJ-MB1SF1M0U  [R2010]  15.5,60 270 bottom
WD1:R3  ERJ-MB1SF1M0U  [R2010]  9.5,60 270 bottom
WD1:U1  DRV8303DCA  [TSSOP-48_PAD]  27.75,63 90 top
WD2:C1  1uF  [C0603]  30.5,12.25 180 bottom
WD2:C2  1uF  [C0603]  30.5,12.25 0 top
WD2:C3  22000pF 50V  [C0603]  30.5,6 90 top
WD2:C4  10000pF 50V  [C0603]  1.75,10 270 bottom
WD2:C5  10000pF 50V  [C0603]  7.75,10 270 bottom
WD2:C6  0.1uF 50V  [C0603]  20.25,3.75 90 bottom
WD2:C7  0.1uF 50V  [C0603]  17.75,6.25 90 bottom
WD2:C8  0.1uF 50V  [C0603]  20.25,8.75 90 bottom
WD2:C9  2.2uF 50V  [C0603]  31,4.75 180 bottom
WD2:C10  0.1uF 50V  [C0603]  17.75,2.25 270 bottom
WD2:C11  EEE-FK1H102AM  [PANASONIC_J16]  28,25.25 180 top
WD2:J1  MINIFITJR_HDR_2X2  [0039301040]  3,29 270 top
WD2:Q1  IRFH7545  [PQFN_5X6_E]  4,17.5 270 top
WD2:Q2  IRFH7545  [PQFN_5X6_E]  4,17.5 90 bottom
WD2:Q3  IRFH7545  [PQFN_5X6_E]  10,17.5 270 top
WD2:Q4  IRFH7545  [PQFN_5X6_E]  10,17.5 90 bottom
WD2:Q5  IRFH7545  [PQFN_5X6_E]  16,17.5 270 top
WD2:Q6  IRFH7545  [PQFN_5X6_E]  16,17.5 90 bottom
WD2:R1  10k  [R0603]  31,7.25 0 bottom
WD2:R2  ERJ-MB1SF1M0U  [R2010]  4.5,10 90 bottom
WD2:R3  ERJ-MB1SF1M0U  [R2010]  10.5,10 90 bottom
WD2:U1  DRV8303DCA  [TSSOP-48_PAD]  23.75,7 90 top
WD3:C1  1uF  [C0603]  85.5,1.75 0 bottom
WD3:C2  1uF  [C0603]  85.5,1.75 180 top
WD3:C3  22000pF 50V  [C0603]  85.5,8 270 top
WD3:C4  10000pF 50V  [C0603]  107.25,10 270 bottom
WD3:C5  10000pF 50V  [C0603]  113.25,10 270 bottom
WD3:C6  0.1uF 50V  [C0603]  95.75,10.25 270 bottom
WD3:C7  0.1uF 50V  [C0603]  98.25,7.75 270 bottom
WD3:C8  0.1uF 50V  [C0603]  95.75,5.25 270 bottom
WD3:C9  2.2uF 50V  [C0603]  85,9.25 0 bottom
WD3:C10  0.1uF 50V  [C0603]  98.25,11.75 90 bottom
WD3:C11  EEE-FK1H102AM  [PANASONIC_J16]  92,25.25 180 top
WD3:J1  MINIFITJR_HDR_2X2  [0039301040]  117,29 90 top
WD3:Q1  IRFH7545  [PQFN_5X6_E]  104,17.5 270 top
WD3:Q2  IRFH7545  [PQFN_5X6_E]  104,17.5 90 bottom
WD3:Q3  IRFH7545  [PQFN_5X6_E]  110,17.5 270 top
WD3:Q4  IRFH7545  [PQFN_5X6_E]  110,17.5 90 bottom
WD3:Q5  IRFH7545  [PQFN_5X6_E]  116,17.5 270 top
WD3:Q6  IRFH7545  [PQFN_5X6_E]  116,17.5 90 bottom
WD3:R1  10k  [R0603]  85,6.75 180 bottom
WD3:R2  ERJ-MB1SF1M0U  [R2010]  104.5,10 90 bottom
WD3:R3  ERJ-MB1SF1M0U  [R2010]  110.5,10 90 bottom
WD3:U1  DRV8303DCA  [TSSOP-48_PAD]  92.25,7 270 top
WD4:C1  1uF  [C0603]  89.5,57.75 0 bottom
WD4:C2  1uF  [C0603]  89.5,57.75 180 top
WD4:C3  22000pF 50V  [C0603]  89.5,64 270 top
WD4:C4  10000pF 50V  [C0603]  118.25,60 90 bottom
WD4:C5  10000pF 50V  [C0603]  112.25,60 90 bottom
WD4:C6  0.1uF 50V  [C0603]  99.75,66.25 270 bottom
WD4:C7  0.1uF 50V  [C0603]  102.25,63.75 270 bottom
WD4:C8  0.1uF 50V  [C0603]  99.75,61.25 270 bottom
WD4:C9  2.2uF 50V  [C0603]  89,65.25 0 bottom
WD4:C10  0.1uF 50V  [C0603]  102.25,67.75 90 bottom
WD4:C11  EEE-FK1H102AM  [PANASONIC_J16]  92,44.75 0 top
WD4:J1  MINIFITJR_HDR_2X2  [0039301040]  117,41 90 top
WD4:Q1  IRFH7545  [PQFN_5X6_E]  116,52.5 90 top
WD4:Q2  IRFH7545  [PQFN_5X6_E]  116,52.5 270 bottom
WD4:Q3  IRFH7545  [PQFN_5X6_E]  110,52.5 90 top
WD4:Q4  IRFH7545  [PQFN_5X6_E]  110,52.5 270 bottom
WD4:Q5  IRFH7545  [PQFN_5X6_E]  104,52.5 90 top
WD4:Q6  IRFH7545  [PQFN_5X6_E]  104,52.5 270 bottom
WD4:R1  10k  [R0603]  89,62.75 180 bottom
WD4:R2  ERJ-MB1SF1M0U  [R2010]  115.5,60 270 bottom
WD4:R3  ERJ-MB1SF1M0U  [R2010]  109.5,60 270 bottom
WD4:U1  DRV8303DCA  [TSSOP-48_PAD]  96.25,63 270 top

### Tracks (layer width: path | path; a pad name or v marks a point on that pad's centre or on a via)
+3.3V  (via drill 0.35)
  Top 0.3: v32.75,66.75 WD1:U1.20 WD1:U1.19 | WD1:U1.45 v22.75,58.75 | WD2:U1.45 v18.75,2.75 | WD2:U1.19 WD2:U1.20 v28.75,10.75 | v87.25,3.25 WD3:U1.20 WD3:U1.19 | WD3:U1.45 v97.25,11.25 | WD4:U1.45 v101.25,67.25 | WD4:U1.19 WD4:U1.20 v91.25,59.25 | DD1:U1.19 v50.75,49.75 | DD1:U1.45 v60.75,57.25
  Bottom 0.3: v22.75,58.75 22.1,58.75 WD1:C10.1 | v18.75,2.75 18.1,2.75 WD2:C10.1 | v97.25,11.25 97.9,11.25 WD3:C10.1 | v101.25,67.25 101.9,67.25 WD4:C10.1 | WD2:C1.1 29.65,11.65 v28.75,10.75 | WD3:C1.1 86.35,2.35 v87.25,3.25 | WD1:C1.1 33.65,67.65 v32.75,66.75 | WD4:C1.1 90.35,58.35 v91.25,59.25 | v60.75,57.25 61.4,57.25 DD1:C1.1 | DD1:C10.1 49.85,48.85 v50.75,49.75 | v32.75,6.75 32.35,6.75 WD2:R1.1 | v83.25,7.25 83.65,7.25 WD3:R1.1 | v87.25,63.25 87.65,63.25 WD4:R1.1 | v36.75,62.75 36.35,62.75 WD1:R1.1 | v46.75,53.25 47.15,53.25 DD1:R1.1
  pour POWER_Layer (isolate 0.2, rank 6, no thermals): 1,69 119,69 119,1 1,1
+18.5V  (via drill 0.35)
  Top 0.3: WD1:U1.25 20.75,68.75 20,68 v20,67.5 | WD2:U1.25 19,12.75 18.75,13 18.75,14 | WD3:U1.25 99.25,1.25 100,2 v100,2.5 | WD4:U1.25 101,57.25 101.25,57 101.25,56 | DD1:U1.25 62.5,47.25 63.25,46.5 63.25,44.5 63.75,44 65.25,44 | R6.2 49.75,12.25 48,14 J2.1
  Bottom 0.3: v20,67.5 v20,55.5 | v100,2.5 v100,14.25
  Bottom 2: 48.75,31.25 48.75,18.77 J2.1
  other vias: 88,38.5 88,37 89,35.75 88.5,32.25 88,33 88,31.5 90,34.25 89,33 89,31.5 90,35.75 89,37 89,38.5 90,38.5 90,37 89.5,32.25 90,31.5 88,35.75 88,34.25 89,34.25 32,38.5 31,38.5 30,38.5 32,37 31,37 30,37 31,35.75 32,34.25 32,31.5 32,33 31.5,37.75 30,34.25 31,33 31,31.5 30,31.5 30,33 31,34.25 32,35.75 30,35.75 65,39 66,39 67,39 68,39 69,39 70,39 65,40 66,40 67,40 68,40 69,40 70,40 64,39 63,39 64,40 63,40 71,40 72,40 71,39 72,39 30.5,37.75 30.5,32.25 31.5,32.25 90,33 88.5,37.75 89.5,37.75 89.5,35 88.5,35 30.5,35 31.5,35 41.25,33.5 42.25,33.5 43.25,33.5 44.25,33.5 45.25,33.5 46.25,33.5 47.25,33.5 48.25,33.5 49.25,33.5 50.25,33.5 40.25,33.5
  pour Top (no thermals): 2,56 20.5,56 23.5,53 23.5,45.5 27,42 29.5,42 32.5,39 32.5,31 29.5,28 27,28 23.5,24.5 23.5,17 20.5,14 2,14 2,18.5 19,18.5 20,19.5 20,50.5 19,51.5 2,51.5
  pour Top (no thermals): 118,14 99.5,14 96.5,17 96.5,24.5 93,28 90.5,28 87.5,31 87.5,39 90.5,42 93,42 96.5,45.5 96.5,53 99.5,56 118,56 118,51.5 101,51.5 100,50.5 100,19.5 101,18.5 118,18.5
  pour Bottom (isolate 0.5, no thermals): 29.5,31 29.5,39 61,39 62.5,40.5 72.5,40.5 74,39 90.5,39 90.5,31
  pour Top (no thermals): 62.5,36.5 62.5,40.5 65.25,43.25 65.25,60.5 69.75,60.5 69.75,43.25 72.5,40.5 72.5,36.5
  pour Top: 40,34 50.5,34 50.5,31.5 47,31.5 47,32 40,32
DD1:N$1
  Top 0.3: DD1:U1.23 DD1:C2.1
DD1:N$2
  Top 0.3: DD1:U1.10 49.6,54.25 DD1:C3.1
DD1:N$3
  Top 0.3: DD1:U1.11 49.6,53.75 DD1:C3.2
DD1:N$4  (via drill 0.35)
  Top 0.3: DD1:U1.9 50.5,54.75 v50.25,55
  Bottom 0.3: v50.25,55 49.6,55 DD1:C9.1
DD1:N$6  (via drill 0.35)
  Top 0.3: DD1:U1.41 61.25,55.25 63,57 63,59.75 63.5,60.25 v64.25,60.25
  Bottom 0.3: v64.25,60.25 65.58,60.25 DD1:Q2.4
DD1:N$8
  Top 0.3: DD1:U1.43 60.75,56.25 62,57.5 62,60.75 63,61.75 70,61.75 71.34,60.41 DD1:Q1.4
DD1:N$10  (via drill 0.35)
  Top 0.3: DD1:U1.36 62.25,52.75 63.75,54.25 v64.25,54.25
  Bottom 0.3: v64.25,54.25 65.58,54.25 DD1:Q4.4
DD1:N$12  (via drill 0.35)
  Top 0.3: DD1:U1.38 61.75,53.75 63.75,55.75 v64.25,55.75 | DD1:Q3.4 71.77,54.98 v71.25,55.5
  Bottom 0.3: v64.25,55.75 71,55.75 v71.25,55.5
DD1:N$13  (via drill 0.35)
  Top 0.3: DD1:U1.44 v58.25,56.75
  Bottom 0.3: v58.25,56.75 58.9,56.75 DD1:C6.1
DD1:N$14  (via drill 0.35)
  Top 0.3: DD1:U1.39 v58.25,54.25
  Bottom 0.3: v58.25,54.25 61.4,54.25 DD1:C7.1
DD1:N$16  (via drill 0.35)
  Top 0.3: DD1:U1.31 60.5,50.25 62.5,48.25 v64.25,48.25
  Bottom 0.3: v64.25,48.25 65.58,48.25 DD1:Q6.4
DD1:N$17  (via drill 0.35)
  Top 0.3: DD1:U1.33 61,51.25 62.5,49.75 v64.25,49.75 | v71.25,49.5 71.77,48.98 DD1:Q5.4
  Bottom 0.3: v64.25,49.75 71,49.75 v71.25,49.5
DD1:N$18  (via drill 0.35)
  Top 0.3: DD1:U1.34 v58.25,51.75
  Bottom 0.3: v58.25,51.75 58.9,51.75 DD1:C8.1
DD1:N$19  (via drill 0.35)
  Top 0.3: DD1:U1.12 50.5,53.25 v50.25,53
  Bottom 0.3: v50.25,53 49.6,53 DD1:R1.2
DD1:PHASE_A  (via drill 0.35)
  Top 0.3: v58.25,55.75 DD1:U1.42 61,55.75 62.5,57.25 62.5,60.25 63.25,61 v64,61
  Bottom 0.3: v58.25,55.75 58.9,55.75 DD1:C6.2 | v64,61 64.5,61 64.75,61.25 67,61.25 67.75,60.5
  Bottom 0.7: 73.5,59.25 73.5,61.25 68,66.75 DD1:J1.1
  other vias: 73.25,57 73.25,58 73.25,59
  pour Top (no thermals): 71.25,59.5 73.75,59.5 73.75,56.5 71.25,56.5
  pour Bottom (no thermals): 73.75,60.5 67.75,60.5 67.75,56.5 73.75,56.5
DD1:PHASE_B  (via drill 0.35)
  Top 0.3: v58.25,53.25 DD1:U1.37 62,53.25 63.75,55 v64,55
  Bottom 0.3: v58.25,53.25 61.4,53.25 DD1:C7.2 | v64,55 64.5,55 64.75,55.25 67,55.25 67.75,54.5
  Bottom 0.7: 73.5,54.25 74.75,55.5 74.75,61.75 70,66.5 DD1:J1.2
  other vias: 73.25,51 73.25,52 73.25,53
  pour Top (no thermals): 71.25,53.5 73.75,53.5 73.75,50.5 71.25,50.5
  pour Bottom (no thermals): 67.75,54.5 73.75,54.5 73.75,50.5 67.75,50.5
DD1:PHASE_C  (via drill 0.35)
  Top 0.3: v58.25,50.75 DD1:U1.32 60.75,50.75 62.5,49 v64,49
  Bottom 0.3: v58.25,50.75 58.9,50.75 DD1:C8.2 | v64,49 64.5,49 64.75,49.25 67,49.25 67.75,48.5
  Bottom 0.7: DD1:J1.3 72,66.25 76,62.25 76,50.75 73.5,48.25
  other vias: 73.25,45 73.25,46 73.25,47
  pour Top (no thermals): 71.25,47.5 73.75,47.5 73.75,44.5 71.25,44.5
  pour Bottom (no thermals): 67.75,48.5 73.75,48.5 73.75,44.5 67.75,44.5
GND  (via drill 0.35)
  Top 0.3: WD1:U1.3 v30.25,58.25 | WD1:U1.24 v30.25,68.75 | WD1:U1.30 v25.25,66.25 | WD1:U1.28 v25.25,67.25 | WD1:U1.26 v25.25,68.25 | WD1:U1.8 v30.25,60.75 | WD1:C1.2 v36.25,68.25 | v25.25,58.25 WD1:U1.46 WD1:U1.47 WD1:U1.48 v25.25,57.25 | WD2:U1.28 v21.25,11.25 | WD2:U1.26 v21.25,12.25 | v21.25,2.25 WD2:U1.46 WD2:U1.47 WD2:U1.48 v21.25,1.25 | WD2:U1.30 v21.25,10.25 | WD2:U1.24 v26.25,12.75 | WD2:U1.8 v26.25,4.75 | WD2:U1.3 v26.25,2.25 | WD2:C1.2 v32.25,12.25 | WD3:U1.3 v89.75,11.75 | WD3:U1.24 v89.75,1.25 | WD3:U1.30 v94.75,3.75 | WD3:U1.28 v94.75,2.75 | WD3:U1.26 v94.75,1.75 | WD3:U1.8 v89.75,9.25 | WD3:C1.2 v83.75,1.75 | v94.75,11.75 WD3:U1.46 WD3:U1.47 WD3:U1.48 v94.75,12.75 | WD4:U1.28 v98.75,58.75 | WD4:U1.26 v98.75,57.75 | v98.75,67.75 WD4:U1.46 WD4:U1.47 WD4:U1.48 v98.75,68.75 | WD4:U1.30 v98.75,59.75 | WD4:U1.24 v93.75,57.25 | WD4:U1.8 v93.75,65.25 | WD4:U1.3 v93.75,67.75 | WD4:C1.2 v87.75,57.75 | U1.13 67.9,24.1 v68.25,23.75 | D1.C v54,3.25 | R2.1 v64.25,20.5 | R1.1 v66.75,20.5 | R3.1 v69.5,20.5 | R5.1 v74.25,21.5 | v58.25,49.75 DD1:U1.30 DD1:U1.29 DD1:U1.28 | DD1:U1.28 v58.25,48.75 | DD1:U1.28 DD1:U1.27 DD1:U1.26 v58.25,47.75 | v58.25,57.75 DD1:U1.46 DD1:U1.47 DD1:U1.48 v58.25,58.75 | DD1:U1.3 v53.25,57.75 | DD1:U1.8 v53.25,55.25 | DD1:U1.24 v53.25,47.25 | DD1:U1.20 v53.25,49.25 | DD1:C2.2 v47.25,47.75 | DD1:U1.35 62.5,52.25 v62.75,52 | DD1:U1.40 61.75,54.75 v62.75,55.75 | R9.1 v41,26.5 | R10.1 v42.75,25.75 | C10.2 v42.75,28 | C2.2 v43.25,29.75
  Bottom 0.3: WD1:C1.2 v36.25,68.25 | WD1:C5.2 7.4,61.5 8,61.5 | WD1:C4.2 13.4,61.5 14,61.5 | v22.75,57.25 21.9,57.25 WD1:C10.2 | v18.75,1.25 17.9,1.25 WD2:C10.2 | WD2:C4.2 2.4,8.5 3,8.5 | WD2:C5.2 8.4,8.5 9,8.5 | WD2:C1.2 v32.25,12.25 | WD3:C1.2 v83.75,1.75 | WD3:C5.2 112.6,8.5 112,8.5 | WD3:C4.2 106.6,8.5 106,8.5 | v97.25,12.75 98.1,12.75 WD3:C10.2 | v101.25,68.75 102.1,68.75 WD4:C10.2 | WD4:C4.2 117.6,61.5 117,61.5 | WD4:C5.2 111.6,61.5 111,61.5 | WD4:C1.2 v87.75,57.75 | v60.75,58.75 61.6,58.75 DD1:C1.2 | DD1:C2.2 v47.25,47.75 | v32.75,5.25 32.35,5.25 WD2:C9.2 | v83.25,8.75 83.65,8.75 WD3:C9.2 | v87.25,64.75 87.65,64.75 WD4:C9.2 | v36.75,61.25 36.35,61.25 WD1:C9.2 | v46.75,54.75 47.15,54.75 DD1:C9.2
  other vias: 4.5,58 15.5,65 9.5,5 3.5,5 26.25,19.75 26.25,52.25 27.75,67.75 28.25,68.75 28.75,67.75 28.25,66.75 27.75,65.75 28.75,65.75 3.5,58 2.5,58 14.5,65 8.5,65 9.5,65 10.5,65 26.25,18.75 26.25,17.75 26.25,51.25 26.25,50.25 15.5,12 16.5,12 17.5,12 26.25,49.25 26.25,48.25 26.25,20.75 26.25,21.75 26.75,65.75 27.25,66.75 26.75,67.75 27.25,68.75 27.75,60.25 26.75,60.25 28.75,60.25 28.25,59.25 27.25,59.25 26.75,58.25 27.75,58.25 28.75,58.25 28.25,57.25 27.25,57.25 23.75,4.25 22.75,4.25 24.75,4.25 24.25,3.25 23.25,3.25 22.75,2.25 23.75,2.25 24.75,2.25 24.25,1.25 23.25,1.25 23.75,9.75 24.75,9.75 22.75,9.75 23.25,10.75 24.25,10.75 23.75,11.75 22.75,11.75 24.75,11.75 24.25,12.75 23.25,12.75 10.5,5 11.5,5 10,6 11,6 4.5,5 5.5,5 5,6 4,6 16.5,65 15,64 16,64 9,64 10,64 115.5,12 104.5,5 110.5,65 116.5,65 93.75,50.25 93.75,17.75 92.25,2.25 91.75,1.25 91.25,2.25 91.75,3.25 92.25,4.25 91.25,4.25 116.5,12 117.5,12 105.5,5 111.5,5 110.5,5 109.5,5 93.75,51.25 93.75,52.25 93.75,18.75 93.75,19.75 104.5,58 103.5,58 102.5,58 93.75,20.75 93.75,21.75 93.75,49.25 93.75,48.25 93.25,4.25 92.75,3.25 93.25,2.25 92.75,1.25 92.25,9.75 93.25,9.75 91.25,9.75 91.75,10.75 92.75,10.75 93.25,11.75 92.25,11.75 91.25,11.75 91.75,12.75 92.75,12.75 96.25,65.75 97.25,65.75 95.25,65.75 95.75,66.75 96.75,66.75 97.25,67.75 96.25,67.75 95.25,67.75 95.75,68.75 96.75,68.75 96.25,60.25 95.25,60.25 97.25,60.25 96.75,59.25 95.75,59.25 96.25,58.25 97.25,58.25 95.25,58.25 95.75,57.25 96.75,57.25 109.5,65 108.5,65 110,64 109,64 115.5,65 114.5,65 115,64 116,64 103.5,5 105,6 104,6 111,6 110,6 16,13 17,13 103,57 104,57 116,13 117,13 3,57 4,57 52.25,11.25 52.25,10.25 52.25,9.25 52.25,8.25 52.25,7.25 52.25,6.25 55.75,57.75 56.25,58.75 56.75,57.75 56.25,56.75 55.75,55.75 56.75,55.75 54.75,55.75 55.25,56.75 54.75,57.75 55.25,58.75 55.75,50.25 54.75,50.25 56.75,50.25 56.25,49.25 55.25,49.25 54.75,48.25 55.75,48.25 56.75,48.25 56.25,47.25 55.25,47.25 64.25,47 64.25,46 64.25,45 64.25,53 64.25,52 64.25,51 64.25,59 64.25,58 64.25,57 51.5,24.5 52.5,24.5 53.5,24.5 54.5,24.5 55.5,24.5 56.5,24.5 57.5,24.5 58.5,24.5 59.5,24.5 51.5,23.5 52.5,23.5 53.5,23.5 54.5,23.5 55.5,23.5 56.5,23.5 57.5,23.5 58.5,23.5 59.5,23.5 39.25,19 39.25,18.25 39.25,20 39.25,20.75
  pour GND_Layer (isolate 0.2, no thermals): 1,69 119,69 119,1 1,1
  pour Top (no thermals): 26.25,69.5 29.25,69.5 29.25,56.5 26.25,56.5
  pour Bottom (no thermals): 5,58.5 2,58.5 2,55 5,55
  pour Bottom (no thermals): 11,65.5 8,65.5 8,61.5 11,61.5
  pour Bottom (no thermals): 17,65.5 14,65.5 14,61.5 17,61.5
  pour Top (no thermals): 25.75,47.5 29.5,47.5 29.5,54.5 25.75,54.5
  pour Bottom (no thermals): 18,15 15,15 15,11.5 18,11.5
  pour Bottom (no thermals): 12,8.5 9,8.5 9,4.5 12,4.5
  pour Bottom (no thermals): 6,8.5 3,8.5 3,4.5 6,4.5
  pour Top (no thermals): 22.25,13.5 25.25,13.5 25.25,0.5 22.25,0.5
  pour Bottom (no thermals): 25.25,13.5 22.25,13.5 22.25,0.5 25.25,0.5
  pour Bottom (no thermals): 29.25,69.5 26.25,69.5 26.25,56.5 29.25,56.5
  pour Top (no thermals): 94.25,47.5 90.5,47.5 90.5,54.5 94.25,54.5
  pour Top (no thermals): 93.75,0.5 90.75,0.5 90.75,13.5 93.75,13.5
  pour Bottom (no thermals): 115,11.5 118,11.5 118,15 115,15
  pour Bottom (no thermals): 109,4.5 112,4.5 112,8.5 109,8.5
  pour Bottom (no thermals): 103,4.5 106,4.5 106,8.5 103,8.5
  pour Bottom (no thermals): 102,55 105,55 105,58.5 102,58.5
  pour Bottom (no thermals): 108,61.5 111,61.5 111,65.5 108,65.5
  pour Bottom (no thermals): 114,61.5 117,61.5 117,65.5 114,65.5
  pour Top (no thermals): 97.75,56.5 94.75,56.5 94.75,69.5 97.75,69.5
  pour Bottom (no thermals): 94.75,56.5 97.75,56.5 97.75,69.5 94.75,69.5
  pour Bottom (no thermals): 90.75,0.5 93.75,0.5 93.75,13.5 90.75,13.5
  pour Top (no thermals): 60,6.5 55.25,6.5 55.25,14 51.5,14 51.5,4.5 60,4.5
  pour Top (no thermals): 25.75,15.5 29.5,15.5 29.5,22.5 25.75,22.5
  pour Top (no thermals): 94.25,15.5 90.5,15.5 90.5,22.5 94.25,22.5
  pour Top (no thermals): 54.25,59.5 57.25,59.5 57.25,46.5 54.25,46.5
  pour Bottom (no thermals): 57.25,59.5 54.25,59.5 54.25,46.5 57.25,46.5
  pour Bottom (no thermals): 64,47.5 64,44.5 66.25,44.5 66.25,47.5
  pour Bottom (no thermals): 64,53.5 64,50.5 66.25,50.5 66.25,53.5
  pour Bottom (no thermals): 64,59.5 64,56.5 66.25,56.5 66.25,59.5
  pour Top (no thermals): 47,28.5 51,28.5 51,30.5 60,30.5 60,23 51,23 51,27.5 47,27.5
  pour Top (no thermals): 39,21 41,21 41,18 39,18
MISO  (via drill 0.35)
  Top 0.3: WD2:U1.6 35.75,3.75 37.25,5.25 37.25,15.75 35,18 35,56.75 36.25,58 39.75,58 40.75,59 v40.75,60.75 | WD3:U1.6 87,10.25 85,12.25 85,62 v84,63 | WD4:U1.6 85.5,66.25 83,63.75 v82.75,63.75 82.25,63.75 82,64 51,64 50.75,63.75 v49.75,63.75 | WD1:U1.6 37.75,59.75 38.5,60.5 38.5,61.25 39.5,62.25 v40.75,62.25 v49.75,62.25 | DD1:U1.6 50.25,56.25 49.75,56.75 v49.75,60.5
  Bottom 0.3: v49.75,60.5 v49.75,62.25 v49.75,63.75 | v82.75,63.75 83.25,63.75 v84,63 | v40.75,60.75 v40.75,62.25
MOSI  (via drill 0.35)
  Top 0.3: WD2:U1.5 36,3.25 37.75,5 37.75,16 35.5,18.25 35.5,56.5 36.5,57.5 40,57.5 41.5,59 41.5,61.5 | WD3:U1.5 87.25,10.75 85.5,12.5 85.5,62.5 v84.75,63.25 | WD1:U1.5 38,59.25 39,60.25 39,61 39.5,61.5 41.5,61.5 | WD4:U1.5 85.25,66.75 83,64.5 v82.5,64.5 v50.5,64.5 | DD1:U1.5 50.75,56.75 50.5,57 v50.5,61.5 41.5,61.5
  Bottom 0.3: v50.5,64.5 v50.5,61.5 | v82.5,64.5 83.5,64.5 v84.75,63.25
N$1
  cutout GND_Layer (no thermals): 107,69 107.5,69 107.5,58.5 100,58.5 100,56.5 99.5,56.5 99.5,59 107,59
  cutout GND_Layer (no thermals): 13,1 12.5,1 12.5,11.5 20,11.5 20,13.5 20.5,13.5 20.5,11 13,11
  cutout GND_Layer (no thermals): 38.5,6.5 38,6.5 38,16.5 47,16.5 47,16 38.5,16
  cutout GND_Layer (no thermals): 18,69 17.5,69 17.5,58.5 20,58.5 20,56.5 20.5,56.5 20.5,59 18,59
  cutout GND_Layer (no thermals): 102,1 102.5,1 102.5,11.5 100,11.5 100,13.5 99.5,13.5 99.5,11 102,11
N$2
  Top 0.3: U1.15 R3.2
N$3
  Top 0.3: U1.10 65.5,24.35 R2.2
N$4
  Top 0.3: U1.12 67.1,23.45 R1.2
N$5
  Top 0.3: S1.1 60,13 58.5,14.5 58.5,18.25 59.75,19.5 71,19.5 71.65,20.15 R5.2 R4.1
N$6
  Top 0.3: S1.2 57,17.5 63.5,24 63.5,26.5 64,27 64.7,27 | U1.16 70.3,26.7 70,27 64.7,27 | U1.9 64.7,27
N$7
  Top 0.3: D1.A 50.25,3.25 49.75,3.75 R6.1
N$8
  Top 0.3: U2.5 45.77,26.73 45.35,27.15 C10.1
N$9
  Top 0.3: R7.2 48.09,30.65 U2.2
N$10
  Top 0.3: U2.3 48.02,29.1 R9.2 R8.2
N$11
  Top 0.3: R11.1 C1.2 45.5,24.75 45.35,24.9 R10.2 47.91,25.75 U2.6
N$12
  Top 0.3: U2.7 48.2,23.2 47.5,22.5 46.5,22.5 | R11.2 F2.1
  pour Top: 42.5,22.5 47,22.5 47,17.5 42.5,17.5
SCK  (via drill 0.35)
  Top 0.3: WD2:U1.7 35.5,4.25 36.75,5.5 36.75,15.5 34.5,17.75 34.5,57 36,58.5 39.5,58.5 40,59 v40,60.5 | WD3:U1.7 86.75,9.75 84.5,12 84.5,61.5 83,63 | WD1:U1.7 37.5,60.25 38,60.75 38,61.5 39.5,63 v40,63 v49,63 50.75,63 51.25,63.5 81.75,63.5 82.25,63 83,63 | WD4:U1.7 85.75,65.75 83,63 | DD1:U1.7 49.75,55.75 49,56.5 v49,60.75
  Bottom 0.3: v49,60.75 v49,63 | v40,60.5 v40,63
VBATT
  Top 0.3: R4.2 75.5,24
  pour Top (no thermals): 75.5,5 79.5,5 79.5,28 72.5,35 62.5,35 62.5,28 73,28 75.5,25.5
VIN
  pour Top (no thermals): 59.5,18.5 71.5,18.5 71.5,5 67.5,5 64,8.5 64,15.5 59.5,15.5
WD1:N$1
  Top 0.3: WD1:C2.1 WD1:U1.23
WD1:N$2
  Top 0.3: WD1:U1.10 33.9,61.75 WD1:C3.1
WD1:N$3
  Top 0.3: WD1:U1.11 33.9,62.25 WD1:C3.2
WD1:N$4  (via drill 0.35)
  Top 0.3: WD1:U1.9 33,61.25 v33.25,61
  Bottom 0.3: v33.25,61 33.9,61 WD1:C9.1
WD1:N$6  (via drill 0.35)
  Top 0.3: WD1:U1.41 19.75,60.75 17.75,58.75 v17.75,57
  Bottom 0.3: v17.75,57 17.75,55.67 WD1:Q2.4
WD1:N$8  (via drill 0.35)
  Top 0.3: WD1:Q1.4 18.48,49.48 v19,50 | v19.25,57 19.25,58.75 20.25,59.75 WD1:U1.43
  Bottom 0.3: v19.25,57 19.25,50.25 v19,50
WD1:N$10  (via drill 0.35)
  Top 0.3: v11.75,57 11.75,59.25 13.5,61 17,61 19.25,63.25 WD1:U1.36
  Bottom 0.3: v11.75,57 11.75,55.67 WD1:Q4.4
WD1:N$12  (via drill 0.35)
  Top 0.3: WD1:Q3.4 12.48,49.48 v13,50 | v13.25,57 13.25,59.25 14,60 17.5,60 19.75,62.25 WD1:U1.38
  Bottom 0.3: v13.25,57 13.25,50.25 v13,50
WD1:N$13  (via drill 0.35)
  Top 0.3: WD1:U1.44 v25.25,59.25
  Bottom 0.3: v25.25,59.25 24.6,59.25 WD1:C6.1
WD1:N$14  (via drill 0.35)
  Top 0.3: WD1:U1.39 v25.25,61.75
  Bottom 0.3: v25.25,61.75 22.1,61.75 WD1:C7.1
WD1:N$16  (via drill 0.35)
  Top 0.3: WD1:U1.31 18.75,65.75 16,63 12.5,63 10.5,61 8,61 5.75,58.75 v5.75,57
  Bottom 0.3: v5.75,57 5.75,55.67 WD1:Q6.4
WD1:N$17  (via drill 0.35)
  Top 0.3: WD1:Q5.4 6.48,49.48 v7,50 | WD1:U1.33 19.25,64.75 16.5,62 13,62 11,60 8.5,60 7.25,58.75 v7.25,57
  Bottom 0.3: v7.25,57 7.25,50.25 v7,50
WD1:N$18  (via drill 0.35)
  Top 0.3: WD1:U1.34 v25.25,64.25
  Bottom 0.3: v25.25,64.25 24.6,64.25 WD1:C8.1
WD1:N$19  (via drill 0.35)
  Top 0.3: WD1:U1.12 33,62.75 v33.25,63
  Bottom 0.3: v33.25,63 33.9,63 WD1:R1.2
WD1:PHASE_A  (via drill 0.35)
  Top 0.3: v25.25,60.25 WD1:U1.42 20,60.25 18.5,58.75 v18.5,57.25
  Bottom 0.3: v25.25,60.25 24.6,60.25 WD1:C6.2 | v18.5,57.25 18.5,56.75 18.75,56.5 18.75,54.25 18,53.5
  other vias: 14.5,48.25 15.5,48.25 16.5,48.25 16,47.5 15,47.5 14.5,46.75 15.5,46.75 16.5,46.75
  pour Bottom (no thermals): 20,46 18,48 18,53.5 14,53.5 14,46.5 15,45.5 17,45.5 18,44.5 18,37.5 17,36.5 13,36.5 12,37.5 12,40.5 8.5,40.5 8.5,36 10,34.5 18,34.5 20,36.5
  pour Top (no thermals): 14,50 17,50 17,46.5 14,46.5
WD1:PHASE_B  (via drill 0.35)
  Top 0.3: v25.25,62.75 WD1:U1.37 19.5,62.75 17.25,60.5 13.75,60.5 12.5,59.25 v12.5,57.25
  Bottom 0.3: v25.25,62.75 22.1,62.75 WD1:C7.2 | v12.5,57.25 12.5,56.75 12.75,56.5 12.75,54.25 12,53.5
  other vias: 8.5,48.25 9.5,48.25 10.5,48.25 10,47.5 9,47.5 8.5,46.75 9.5,46.75 10.5,46.75
  pour Bottom (no thermals): 8,53.5 12,53.5 12,41.5 8.5,41.5 8.5,46 8,46.5
  pour Top (no thermals): 8,50 11,50 11,46.5 8,46.5
WD1:PHASE_C  (via drill 0.35)
  Top 0.3: v25.25,65.25 WD1:U1.32 19,65.25 16.25,62.5 12.75,62.5 10.75,60.5 8.25,60.5 6.5,58.75 v6.5,57.25
  Bottom 0.3: 24.1,65.25 WD1:C8.2 24.6,65.25 v25.25,65.25 | v6.5,57.25 6.5,56.75 6.75,56.5 6.75,54.25 6,53.5
  other vias: 2.5,48.25 3.5,48.25 4.5,48.25 3,47.5 4,47.5 4.5,46.75 3.5,46.75 2.5,46.75
  pour Top (no thermals): 2,50 5,50 5,46.5 8,43.5 8,37.5 9,36.5 12.5,36.5 14,38 14,40.5 17.5,40.5 17.5,37.5 14.5,34.5 7.5,34.5 6,36 6,42 2,46
  pour Bottom (no thermals): 2,53.5 6,53.5 6,46.5 2,46.5
WD1:S1  (via drill 0.35)
  Top 0.3: WD1:U1.40 21,61.25 v20.75,61.5 19.75,61.5 17.5,59.25 v17,59.25 | WD1:U1.29 21,66.75 v20.75,66.5
  Bottom 0.3: v20.75,66.5 v20.75,61.5 | v17,59.25 17,58.25 | WD1:C4.1 13.4,58.5 14,58.5
  pour Bottom (no thermals): 17,58.5 14,58.5 14,55 17,55
WD1:S2  (via drill 0.35)
  Top 0.3: WD1:U1.35 23,63.75 v22.75,64 19.25,64 16.75,61.5 13.25,61.5 v11,59.25 | WD1:U1.27 23,67.75 v22.75,67.5
  Bottom 0.3: v22.75,64 v22.75,67.5 | v11,59.25 11,58.5 | WD1:C5.1 7.4,58.5 8,58.5
  pour Bottom (no thermals): 11,58.5 8,58.5 8,55 11,55
WD2:N$1
  Top 0.3: WD2:U1.23 WD2:C2.1
WD2:N$2
  Top 0.3: WD2:U1.10 29.9,5.75 WD2:C3.1
WD2:N$3
  Top 0.3: WD2:U1.11 29.9,6.25 WD2:C3.2
WD2:N$4  (via drill 0.35)
  Top 0.3: WD2:U1.9 29,5.25 v29.25,5
  Bottom 0.3: v29.25,5 29.9,5 WD2:C9.1
WD2:N$6  (via drill 0.35)
  Top 0.3: WD2:U1.41 14.75,4.75 11.5,8 8,8 6,10 3,10 2.25,10.75 v2.25,13
  Bottom 0.3: WD2:Q2.4 2.25,14.32 v2.25,13
WD2:N$8  (via drill 0.35)
  Top 0.3: WD2:U1.43 14.25,3.75 11,7 7.5,7 5.5,9 2.5,9 0.75,10.75 v0.75,13 | WD2:Q1.4 1.52,20.52 v1,20
  Bottom 0.3: v1,20 0.75,19.75 v0.75,13
WD2:N$10  (via drill 0.35)
  Top 0.3: WD2:U1.36 15.25,7.25 12.5,10 9,10 8.25,10.75 v8.25,13
  Bottom 0.3: WD2:Q4.4 8.25,14.32 v8.25,13
WD2:N$12  (via drill 0.35)
  Top 0.3: WD2:Q3.4 7.52,20.52 v7,20 | v6.75,13 6.75,10.75 8.5,9 12,9 14.75,6.25 WD2:U1.38
  Bottom 0.3: v6.75,13 6.75,19.75 v7,20
WD2:N$13  (via drill 0.35)
  Top 0.3: WD2:U1.44 v21.25,3.25
  Bottom 0.3: v21.25,3.25 20.6,3.25 WD2:C6.1
WD2:N$14  (via drill 0.35)
  Top 0.3: WD2:U1.39 v21.25,5.75
  Bottom 0.3: v21.25,5.75 18.1,5.75 WD2:C7.1
WD2:N$16  (via drill 0.35)
  Top 0.3: WD2:U1.31 15.75,9.75 14.25,11.25 v14.25,13
  Bottom 0.3: WD2:Q6.4 14.25,14.32 v14.25,13
WD2:N$17  (via drill 0.35)
  Top 0.3: WD2:Q5.4 13.52,20.52 v13,20 | v12.75,13 12.75,11.25 15.25,8.75 WD2:U1.33
  Bottom 0.3: v13,20 12.75,19.75 v12.75,13
WD2:N$18  (via drill 0.35)
  Top 0.3: WD2:U1.34 v21.25,8.25
  Bottom 0.3: v21.25,8.25 20.6,8.25 WD2:C8.1
WD2:N$19  (via drill 0.35)
  Top 0.3: WD2:U1.12 29,6.75 v29.25,7
  Bottom 0.3: v29.25,7 29.9,7 WD2:R1.2
WD2:PHASE_A  (via drill 0.35)
  Top 0.3: v21.25,4.25 WD2:U1.42 14.5,4.25 11.25,7.5 7.75,7.5 5.75,9.5 2.75,9.5 1.5,10.75 v1.5,12.75
  Bottom 0.3: v21.25,4.25 20.6,4.25 WD2:C6.2 | v1.5,12.75 1.5,13.25 1.25,13.5 1.25,15.75 2,16.5
  other vias: 3.5,21.75 4.5,21.75 5.5,21.75 4,22.5 5,22.5 5.5,23.25 4.5,23.25 3.5,23.25
  pour Top (no thermals): 3,24.5 7,28.5 12,28.5 12,25.5 8,25.5 6,23.5 6,20 3,20
  pour Bottom (no thermals): 6,23.5 2,23.5 2,16.5 6,16.5
WD2:PHASE_B  (via drill 0.35)
  Top 0.3: v21.25,6.75 WD2:U1.37 15,6.75 12.25,9.5 8.75,9.5 7.5,10.75 v7.5,12.75
  Bottom 0.3: v21.25,6.75 18.1,6.75 WD2:C7.2 | v7.5,12.75 7.5,13.25 7.25,13.5 7.25,15.75 8,16.5
  other vias: 9.5,21.75 10.5,21.75 11.5,21.75 10,22.5 11,22.5 11.5,23.25 10.5,23.25 9.5,23.25
  pour Top (no thermals): 9,23.5 12,23.5 12,20 9,20
  pour Bottom (no thermals): 12,23.5 10.5,23.5 8,26 8,28.5 9,29.5 12,29.5 12,32.5 9,32.5 6,29.5 6,25 8,23 8,16.5 12,16.5
WD2:PHASE_C  (via drill 0.35)
  Top 0.3: v21.25,9.25 WD2:U1.32 15.5,9.25 13.5,11.25 v13.5,12.75
  Bottom 0.3: v21.25,9.25 20.6,9.25 WD2:C8.2 | v13.5,12.75 13.5,13.25 13.25,13.5 13.25,15.75 14,16.5
  other vias: 15.5,21.75 16.5,21.75 17.5,21.75 17.5,23.25 16.5,23.25 15.5,23.25 16,22.5 17,22.5
  pour Top (no thermals): 14,28.5 18,28.5 18,20 15,20 15,25 14,26
  pour Bottom (no thermals): 18,23.5 14,23.5 14,16.5 18,16.5
WD2:S1  (via drill 0.35)
  Top 0.3: WD2:U1.40 17,5.25 v16.75,5.5 14.75,5.5 11.75,8.5 8.25,8.5 v6,10.75 | WD2:U1.29 17,10.75 v16.75,10.5
  Bottom 0.3: v16.75,5.5 v16.75,10.5 | WD2:C4.1 2.4,11.5 3,11.5 | v6,10.75 6,11.5
  pour Bottom (no thermals): 3,15 6,15 6,11.5 3,11.5
WD2:S2  (via drill 0.35)
  Top 0.3: WD2:U1.35 19,7.75 v18.75,8 15.25,8 12.5,10.75 v12,10.75 | WD2:U1.27 19,11.75 v18.75,11.5
  Bottom 0.3: v18.75,8 v18.75,11.5 | WD2:C5.1 8.4,11.5 9,11.5 | v12,10.75 12,11.5
  pour Bottom (no thermals): 9,15 12,15 12,11.5 9,11.5
WD3:N$1
  Top 0.3: WD3:C2.1 WD3:U1.23
WD3:N$2
  Top 0.3: WD3:U1.10 86.1,8.25 WD3:C3.1
WD3:N$3
  Top 0.3: WD3:U1.11 86.1,7.75 WD3:C3.2
WD3:N$4  (via drill 0.35)
  Top 0.3: WD3:U1.9 87,8.75 v86.75,9
  Bottom 0.3: v86.75,9 86.1,9 WD3:C9.1
WD3:N$6  (via drill 0.35)
  Top 0.3: WD3:U1.41 100.25,9.25 102.25,11.25 v102.25,13
  Bottom 0.3: v102.25,13 102.25,14.32 WD3:Q2.4
WD3:N$8  (via drill 0.35)
  Top 0.3: WD3:Q1.4 101.52,20.52 v101,20 | v100.75,13 100.75,11.25 99.75,10.25 WD3:U1.43
  Bottom 0.3: v100.75,13 100.75,19.75 v101,20
WD3:N$10  (via drill 0.35)
  Top 0.3: v108.25,13 108.25,10.75 106.5,9 103,9 100.75,6.75 WD3:U1.36
  Bottom 0.3: v108.25,13 108.25,14.32 WD3:Q4.4
WD3:N$12  (via drill 0.35)
  Top 0.3: WD3:Q3.4 107.52,20.52 v107,20 | v106.75,13 106.75,10.75 106,10 102.5,10 100.25,7.75 WD3:U1.38
  Bottom 0.3: v106.75,13 106.75,19.75 v107,20
WD3:N$13  (via drill 0.35)
  Top 0.3: WD3:U1.44 v94.75,10.75
  Bottom 0.3: v94.75,10.75 95.4,10.75 WD3:C6.1
WD3:N$14  (via drill 0.35)
  Top 0.3: WD3:U1.39 v94.75,8.25
  Bottom 0.3: v94.75,8.25 97.9,8.25 WD3:C7.1
WD3:N$16  (via drill 0.35)
  Top 0.3: WD3:U1.31 101.25,4.25 104,7 107.5,7 109.5,9 112,9 114.25,11.25 v114.25,13
  Bottom 0.3: v114.25,13 114.25,14.32 WD3:Q6.4
WD3:N$17  (via drill 0.35)
  Top 0.3: WD3:Q5.4 113.52,20.52 v113,20 | WD3:U1.33 100.75,5.25 103.5,8 107,8 109,10 111.5,10 112.75,11.25 v112.75,13
  Bottom 0.3: v112.75,13 112.75,19.75 v113,20
WD3:N$18  (via drill 0.35)
  Top 0.3: WD3:U1.34 v94.75,5.75
  Bottom 0.3: v94.75,5.75 95.4,5.75 WD3:C8.1
WD3:N$19  (via drill 0.35)
  Top 0.3: WD3:U1.12 87,7.25 v86.75,7
  Bottom 0.3: v86.75,7 86.1,7 WD3:R1.2
WD3:PHASE_A  (via drill 0.35)
  Top 0.3: v94.75,9.75 WD3:U1.42 100,9.75 101.5,11.25 v101.5,12.75
  Bottom 0.3: v94.75,9.75 95.4,9.75 WD3:C6.2 | v101.5,12.75 101.5,13.25 101.25,13.5 101.25,15.75 102,16.5
  other vias: 105.5,21.75 104.5,21.75 103.5,21.75 104,22.5 105,22.5 105.5,23.25 104.5,23.25 103.5,23.25
  pour Bottom (no thermals): 100,24 102,22 102,16.5 106,16.5 106,23.5 105,24.5 103,24.5 102,25.5 102,32.5 103,33.5 107,33.5 108,32.5 108,29.5 111.5,29.5 111.5,34 110,35.5 102,35.5 100,33.5
  pour Top (no thermals): 106,20 103,20 103,23.5 106,23.5
WD3:PHASE_B  (via drill 0.35)
  Top 0.3: v94.75,7.25 WD3:U1.37 100.5,7.25 102.75,9.5 106.25,9.5 107.5,10.75 v107.5,12.75
  Bottom 0.3: v94.75,7.25 97.9,7.25 WD3:C7.2 | v107.5,12.75 107.5,13.25 107.25,13.5 107.25,15.75 108,16.5
  other vias: 111.5,21.75 110.5,21.75 109.5,21.75 110,22.5 111,22.5 111.5,23.25 110.5,23.25 109.5,23.25
  pour Bottom (no thermals): 112,16.5 108,16.5 108,28.5 111.5,28.5 111.5,24 112,23.5
  pour Top (no thermals): 112,20 109,20 109,23.5 112,23.5
WD3:PHASE_C  (via drill 0.35)
  Top 0.3: v94.75,4.75 WD3:U1.32 101,4.75 103.75,7.5 107.25,7.5 109.25,9.5 111.75,9.5 113.5,11.25 v113.5,12.75
  Bottom 0.3: 95.9,4.75 WD3:C8.2 95.4,4.75 v94.75,4.75 | v113.5,12.75 113.5,13.25 113.25,13.5 113.25,15.75 114,16.5
  other vias: 117.5,21.75 116.5,21.75 115.5,21.75 117,22.5 116,22.5 115.5,23.25 116.5,23.25 117.5,23.25
  pour Top (no thermals): 118,20 115,20 115,23.5 112,26.5 112,32.5 111,33.5 107.5,33.5 106,32 106,29.5 102.5,29.5 102.5,32.5 105.5,35.5 112.5,35.5 114,34 114,28 118,24
  pour Bottom (no thermals): 118,16.5 114,16.5 114,23.5 118,23.5
WD3:S1  (via drill 0.35)
  Top 0.3: WD3:U1.40 99,8.75 v99.25,8.5 100.25,8.5 102.5,10.75 v103,10.75 | WD3:U1.29 99,3.25 v99.25,3.5
  Bottom 0.3: v103,10.75 103,11.75 | WD3:C4.1 106.6,11.5 106,11.5 | v99.25,3.5 v99.25,8.5
  pour Bottom (no thermals): 103,11.5 106,11.5 106,15 103,15
WD3:S2  (via drill 0.35)
  Top 0.3: WD3:U1.35 97,6.25 v97.25,6 100.75,6 103.25,8.5 106.75,8.5 v109,10.75 | WD3:U1.27 97,2.25 v97.25,2.5
  Bottom 0.3: v109,10.75 109,11.5 | WD3:C5.1 112.6,11.5 112,11.5 | v97.25,2.5 v97.25,6
  pour Bottom (no thermals): 109,11.5 112,11.5 112,15 109,15
WD4:N$1
  Top 0.3: WD4:C2.1 WD4:U1.23
WD4:N$2
  Top 0.3: WD4:U1.10 90.1,64.25 WD4:C3.1
WD4:N$3
  Top 0.3: WD4:U1.11 90.1,63.75 WD4:C3.2
WD4:N$4  (via drill 0.35)
  Top 0.3: WD4:U1.9 91,64.75 v90.75,65
  Bottom 0.3: v90.75,65 90.1,65 WD4:C9.1
WD4:N$6  (via drill 0.35)
  Top 0.3: WD4:U1.41 105.25,65.25 108.5,62 112,62 114,60 117,60 117.75,59.25 v117.75,57
  Bottom 0.3: WD4:Q2.4 117.75,55.67 v117.75,57
WD4:N$8  (via drill 0.35)
  Top 0.3: WD4:U1.43 105.75,66.25 109,63 112.5,63 114.5,61 117.5,61 119.25,59.25 v119.25,57 | WD4:Q1.4 118.48,49.48 v119,50
  Bottom 0.3: v119,50 119.25,50.25 v119.25,57
WD4:N$10  (via drill 0.35)
  Top 0.3: WD4:U1.36 104.75,62.75 107.5,60 111,60 111.75,59.25 v111.75,57
  Bottom 0.3: WD4:Q4.4 111.75,55.67 v111.75,57
WD4:N$12  (via drill 0.35)
  Top 0.3: WD4:Q3.4 112.48,49.48 v113,50 | v113.25,57 113.25,59.25 111.5,61 108,61 105.25,63.75 WD4:U1.38
  Bottom 0.3: v113.25,57 113.25,50.25 v113,50
WD4:N$13  (via drill 0.35)
  Top 0.3: WD4:U1.44 v98.75,66.75
  Bottom 0.3: v98.75,66.75 99.4,66.75 WD4:C6.1
WD4:N$14  (via drill 0.35)
  Top 0.3: WD4:U1.39 v98.75,64.25
  Bottom 0.3: v98.75,64.25 101.9,64.25 WD4:C7.1
WD4:N$16  (via drill 0.35)
  Top 0.3: WD4:U1.31 104.25,60.25 105.75,58.75 v105.75,57
  Bottom 0.3: WD4:Q6.4 105.75,55.67 v105.75,57
WD4:N$17  (via drill 0.35)
  Top 0.3: WD4:Q5.4 106.48,49.48 v107,50 | v107.25,57 107.25,58.75 104.75,61.25 WD4:U1.33
  Bottom 0.3: v107,50 107.25,50.25 v107.25,57
WD4:N$18  (via drill 0.35)
  Top 0.3: WD4:U1.34 v98.75,61.75
  Bottom 0.3: v98.75,61.75 99.4,61.75 WD4:C8.1
WD4:N$19  (via drill 0.35)
  Top 0.3: WD4:U1.12 91,63.25 v90.75,63
  Bottom 0.3: v90.75,63 90.1,63 WD4:R1.2
WD4:PHASE_A  (via drill 0.35)
  Top 0.3: v98.75,65.75 WD4:U1.42 105.5,65.75 108.75,62.5 112.25,62.5 114.25,60.5 117.25,60.5 118.5,59.25 v118.5,57.25
  Bottom 0.3: v98.75,65.75 99.4,65.75 WD4:C6.2 | v118.5,57.25 118.5,56.75 118.75,56.5 118.75,54.25 118,53.5
  other vias: 116.5,48.25 115.5,48.25 114.5,48.25 116,47.5 115,47.5 114.5,46.75 115.5,46.75 116.5,46.75
  pour Top (no thermals): 117,45.5 113,41.5 108,41.5 108,44.5 112,44.5 114,46.5 114,50 117,50
  pour Bottom (no thermals): 114,46.5 118,46.5 118,53.5 114,53.5
WD4:PHASE_B  (via drill 0.35)
  Top 0.3: v98.75,63.25 WD4:U1.37 105,63.25 107.75,60.5 111.25,60.5 112.5,59.25 v112.5,57.25
  Bottom 0.3: v98.75,63.25 101.9,63.25 WD4:C7.2 | v112.5,57.25 112.5,56.75 112.75,56.5 112.75,54.25 112,53.5
  other vias: 110.5,48.25 109.5,48.25 108.5,48.25 110,47.5 109,47.5 108.5,46.75 109.5,46.75 110.5,46.75
  pour Top (no thermals): 111,46.5 108,46.5 108,50 111,50
  pour Bottom (no thermals): 108,46.5 109.5,46.5 112,44 112,41.5 111,40.5 108,40.5 108,37.5 111,37.5 114,40.5 114,45 112,47 112,53.5 108,53.5
WD4:PHASE_C  (via drill 0.35)
  Top 0.3: v98.75,60.75 WD4:U1.32 104.5,60.75 106.5,58.75 v106.5,57.25
  Bottom 0.3: v98.75,60.75 99.4,60.75 WD4:C8.2 | v106.5,57.25 106.5,56.75 106.75,56.5 106.75,54.25 106,53.5
  other vias: 104.5,48.25 103.5,48.25 102.5,48.25 102.5,46.75 103.5,46.75 104.5,46.75 104,47.5 103,47.5
  pour Top (no thermals): 106,41.5 102,41.5 102,50 105,50 105,45 106,44
  pour Bottom (no thermals): 102,46.5 106,46.5 106,53.5 102,53.5
WD4:S1  (via drill 0.35)
  Top 0.3: WD4:U1.40 103,64.75 v103.25,64.5 105.25,64.5 108.25,61.5 111.75,61.5 v114,59.25 | WD4:U1.29 103,59.25 v103.25,59.5
  Bottom 0.3: WD4:C4.1 117.6,58.5 117,58.5 | v114,59.25 114,58.5 | v103.25,64.5 v103.25,59.5
  pour Bottom (no thermals): 117,55 114,55 114,58.5 117,58.5
WD4:S2  (via drill 0.35)
  Top 0.3: WD4:U1.35 101,62.25 v101.25,62 104.75,62 107.5,59.25 v108,59.25 | WD4:U1.27 101,58.25 v101.25,58.5
  Bottom 0.3: WD4:C5.1 111.6,58.5 111,58.5 | v108,59.25 108,58.5 | v101.25,62 v101.25,58.5
  pour Bottom (no thermals): 111,55 108,55 108,58.5 111,58.5

### Text on the board
tPlace: ON | OFF